# EAGLE design starfish (EAGLE 9.5.1)

## Sheet 1 of 6: POWER
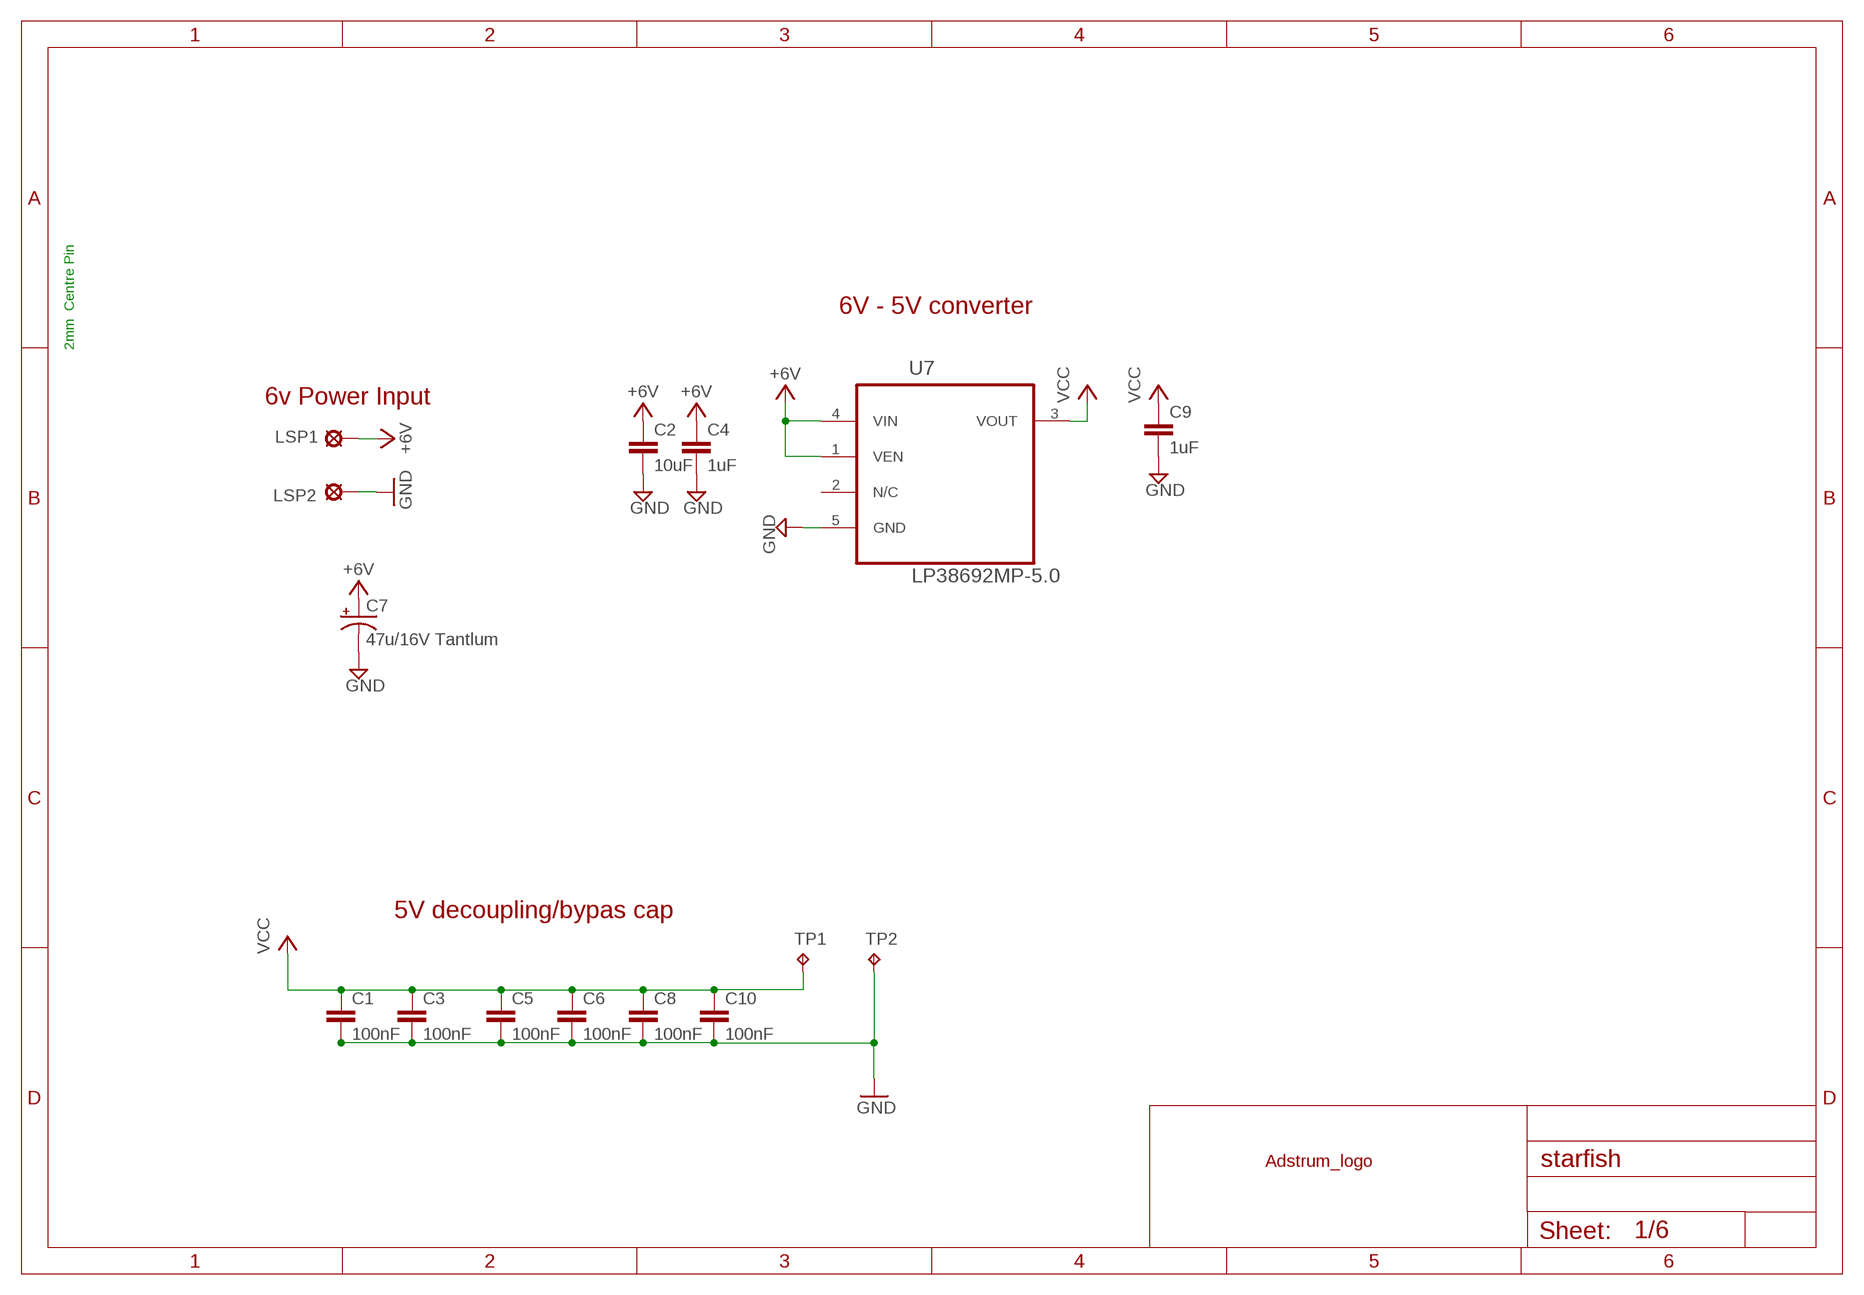
[diagram p0: schematic, sheet 1]

### Parts
C1  100nF  C-EUC1210  [C1210]
C2  10uF  C-EUC0805  [C0805]
C3  100nF  C-EUC0603  [C0603]
C4  1uF  C-EUC0805  [C0805]
C5  100nF  C-EUC0603  [C0603]
C6  100nF  C-EUC0603  [C0603]
C7  47u/16V Tantlum  CPOL-USC/6032-28R  [C/6032-28R]
C8  100nF  C-EUC0603  [C0603]
C9  1uF  C-EUC0805  [C0805]
C10  100nF  C-EUC0603  [C0603]
LSP1  LSP10  [LSP10]
LSP2  LSP10  [LSP10]
TP1  vcc  TPB1,27  [B1,27]
TP2  gnd  TPB1,27  [B1,27]
U7  LP38692MP-5.0  [SOT150P696X180-5N]
U$16  ADSTRUM_LOGO  [ADSTRUM_LOGO]

### Nets
+6V: C2.1 C4.1 C7.+ LSP1.MP U7.1(VEN) U7.4(VIN) ; also sheet 3,4,5
GND: C1.2 C2.2 C3.2 C4.2 C5.2 C6.2 C7.- C8.2 C9.2 C10.2 LSP2.MP TP2.TP U7.5(GND) ; also sheet 2,3,4,5,6
VCC: C1.1 C3.1 C5.1 C6.1 C8.1 C9.1 C10.1 TP1.TP U7.3(VOUT) ; also sheet 2,3,4,5,6
Unconnected: U7.2(N/C)

### Notes on the sheet
- 6V - 5V converter
- 2mm  Centre Pin
- 6v Power Input
- 5V decoupling/bypas cap

## Sheet 2 of 6: ATMEGA 2560
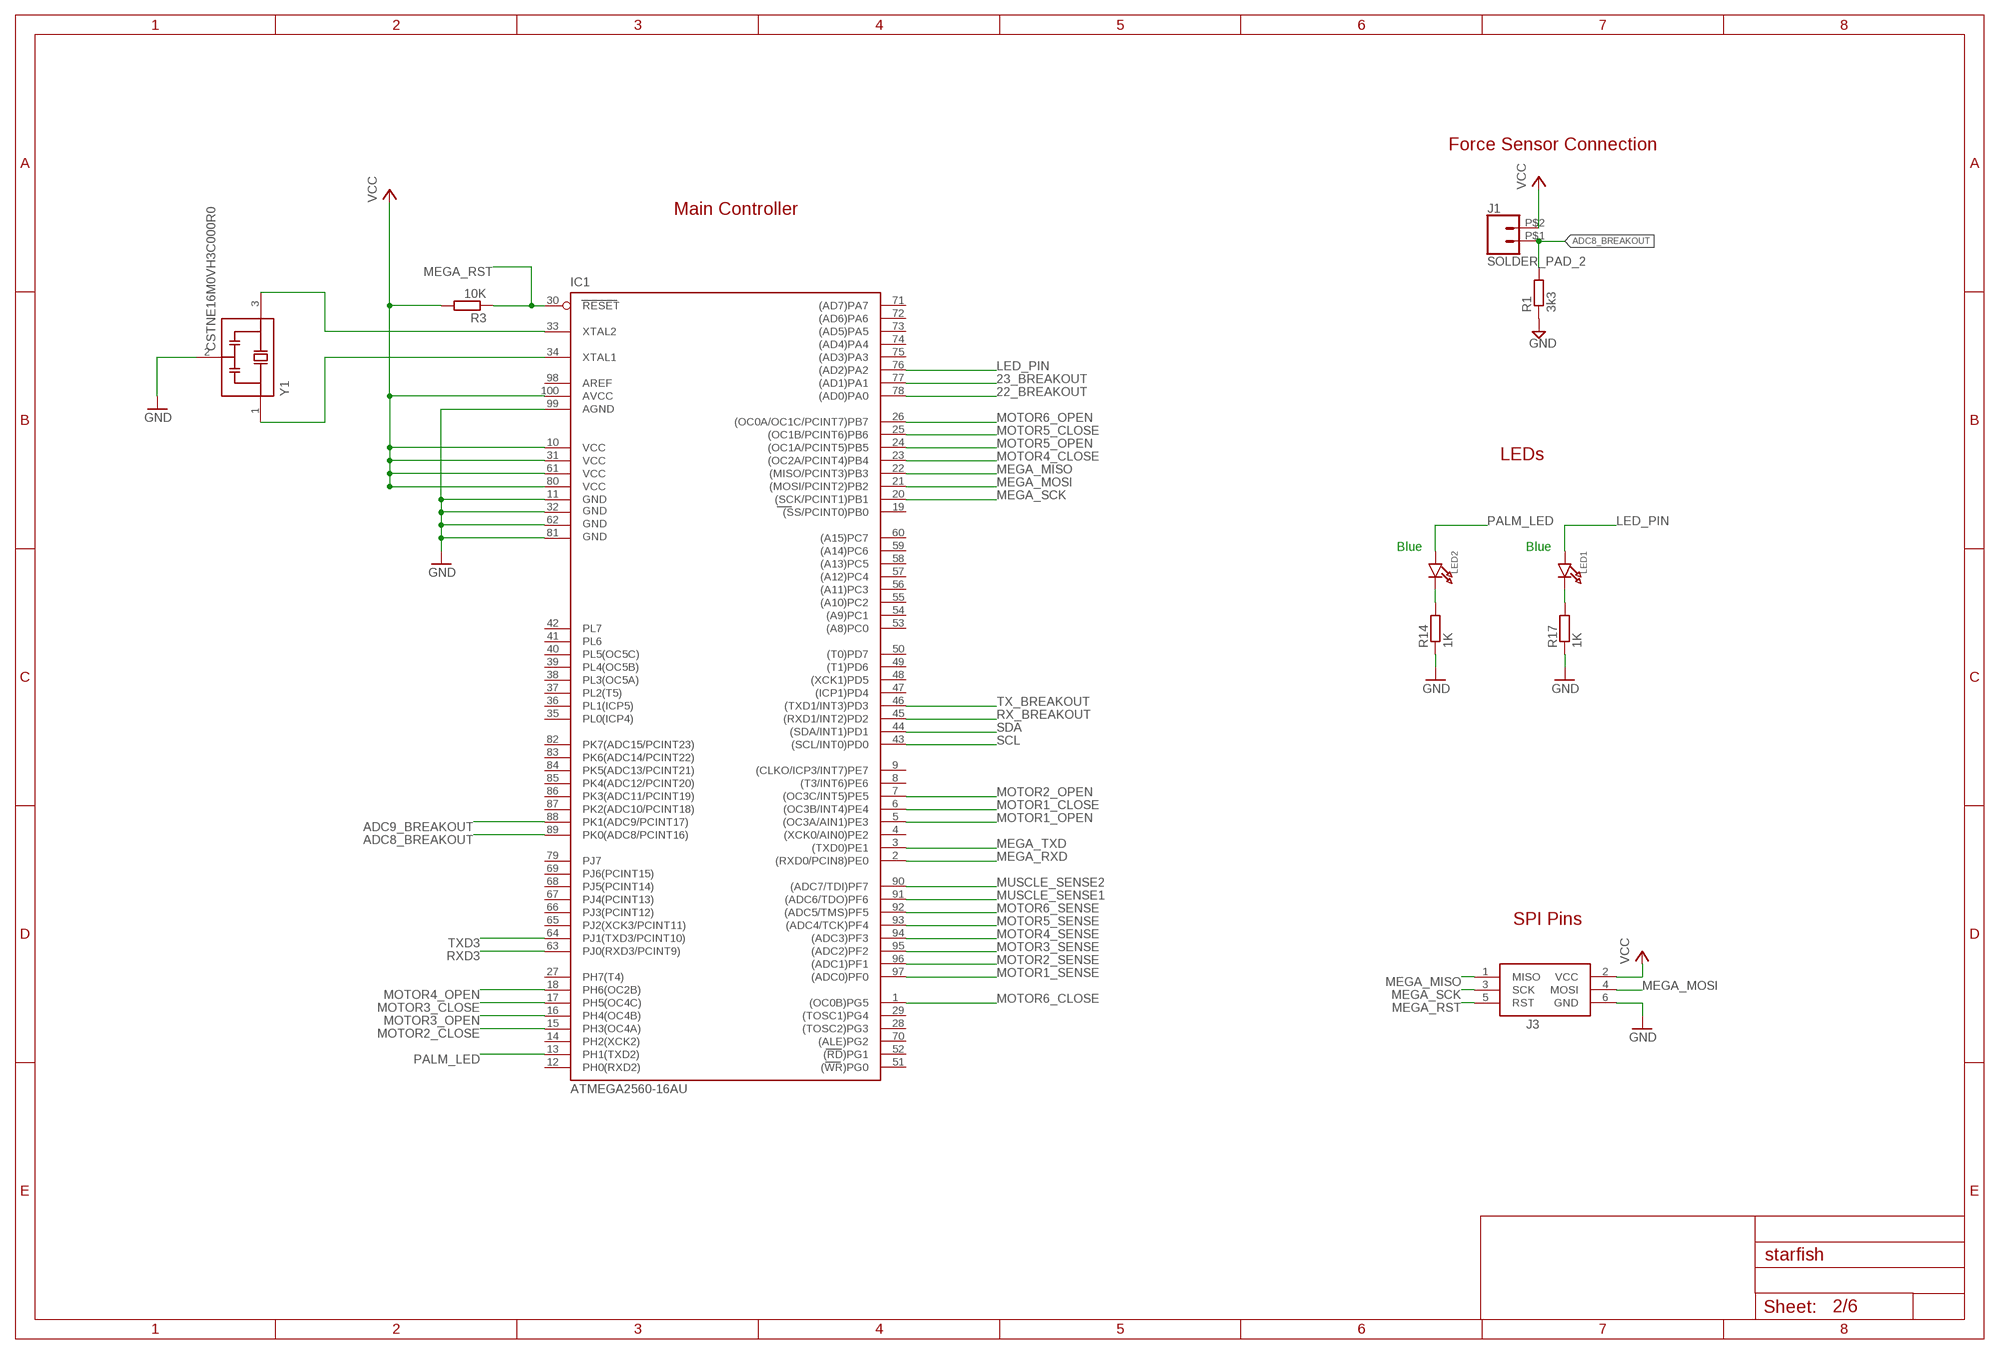
[diagram p1: schematic, sheet 2]

### Parts
IC1  ATMEGA2560-16AU  [TQFP100]
J1  SOLDER_PAD_2  [SOLDER_PAD_2]
J3  DNF  AVRISP-6  [AVRISP]
LED1  LED0805  [CHIPLED_0805]
LED2  LED0805  [CHIPLED_0805]
R1  3k3  R-EU_R0603  [R0603]
R3  10K  R-EU_R0603  [R0603]
R14  1K  R-EU_R0603  [R0603]
R17  1K  R-EU_R0603  [R0603]
Y1  CSTNE16M0VH3C000R0  [OSC_CSTNE16M0VH3C000R0]

### Nets
22_BREAKOUT: IC1.78((AD0)PA0)
23_BREAKOUT: IC1.77((AD1)PA1)
ADC8_BREAKOUT: IC1.89(PK0(ADC8/PCINT16)) J1.P$1 R1.2
ADC9_BREAKOUT: IC1.88(PK1(ADC9/PCINT17))
GND: IC1.11(GND) IC1.32(GND1) IC1.62(GND2) IC1.81(GND3) IC1.99(AGND) J3.6(GND) R1.1 R14.1 R17.1 Y1.2(GND) ; also sheet 1,3,4,5,6
LED_PIN: IC1.76((AD2)PA2) LED1.A
MEGA_MISO: IC1.22((MISO/PCINT3)PB3) J3.1(MISO)
MEGA_MOSI: IC1.21((MOSI/PCINT2)PB2) J3.4(MOSI)
MEGA_RST: IC1.30(RESET) J3.5(RST) R3.1 ; also sheet 6
MEGA_RXD: IC1.2((RXD0/PCIN8)PE0) ; also sheet 6
MEGA_SCK: IC1.20((SCK/PCINT1)PB1) J3.3(SCK)
MEGA_TXD: IC1.3((TXD0)PE1) ; also sheet 6
MOTOR1_CLOSE: IC1.6((OC3B/INT4)PE4) ; also sheet 3
MOTOR1_OPEN: IC1.5((OC3A/AIN1)PE3) ; also sheet 3
MOTOR1_SENSE: IC1.97((ADC0)PF0) ; also sheet 3
MOTOR2_CLOSE: IC1.15(PH3(OC4A)) ; also sheet 3
MOTOR2_OPEN: IC1.7((OC3C/INT5)PE5) ; also sheet 3
MOTOR2_SENSE: IC1.96((ADC1)PF1) ; also sheet 3
MOTOR3_CLOSE: IC1.17(PH5(OC4C)) ; also sheet 4
MOTOR3_OPEN: IC1.16(PH4(OC4B)) ; also sheet 4
MOTOR3_SENSE: IC1.95((ADC2)PF2) ; also sheet 3
MOTOR4_CLOSE: IC1.23((OC2A/PCINT4)PB4) ; also sheet 4
MOTOR4_OPEN: IC1.18(PH6(OC2B)) ; also sheet 4
MOTOR4_SENSE: IC1.94((ADC3)PF3) ; also sheet 3
MOTOR5_CLOSE: IC1.25((OC1B/PCINT6)PB6) ; also sheet 5
MOTOR5_OPEN: IC1.24((OC1A/PCINT5)PB5) ; also sheet 5
MOTOR5_SENSE: IC1.93((ADC4/TCK)PF4) ; also sheet 3
MOTOR6_CLOSE: IC1.1((OC0B)PG5) ; also sheet 5
MOTOR6_OPEN: IC1.26((OC0A/OC1C/PCINT7)PB7) ; also sheet 5
MOTOR6_SENSE: IC1.92((ADC5/TMS)PF5) ; also sheet 3
MUSCLE_SENSE1: IC1.91((ADC6/TDO)PF6) ; also sheet 6
MUSCLE_SENSE2: IC1.90((ADC7/TDI)PF7) ; also sheet 6
N$2: LED1.C R17.2
N$3: IC1.34(XTAL1) Y1.1(IN)
N$4: LED2.C R14.2
N$5: IC1.33(XTAL2) Y1.3(OUT)
PALM_LED: IC1.13(PH1(TXD2)) LED2.A
RX_BREAKOUT: IC1.45((RXD1/INT2)PD2)
RXD3: IC1.63(PJ0(RXD3/PCINT9)) ; also sheet 6
SCL: IC1.43((SCL/INT0)PD0) ; also sheet 6
SDA: IC1.44((SDA/INT1)PD1) ; also sheet 6
TX_BREAKOUT: IC1.46((TXD1/INT3)PD3)
TXD3: IC1.64(PJ1(TXD3/PCINT10)) ; also sheet 6
VCC: IC1.10(VCC) IC1.31(VCC1) IC1.61(VCC2) IC1.80(VCC3) IC1.100(AVCC) J1.P$2 J3.2(VCC) R3.2 ; also sheet 1,3,4,5,6
Unconnected: IC1.4((XCK0/AIN0)PE2) IC1.8((T3/INT6)PE6) IC1.9((CLKO/ICP3/INT7)PE7) IC1.12(PH0(RXD2)) IC1.14(PH2(XCK2)) IC1.19((SS/PCINT0)PB0) IC1.27(PH7(T4)) IC1.28((TOSC2)PG3) IC1.29((TOSC1)PG4) IC1.35(PL0(ICP4)) IC1.36(PL1(ICP5)) IC1.37(PL2(T5)) IC1.38(PL3(OC5A)) IC1.39(PL4(OC5B)) IC1.40(PL5(OC5C)) IC1.41(PL6) IC1.42(PL7) IC1.47((ICP1)PD4) IC1.48((XCK1)PD5) IC1.49((T1)PD6) IC1.50((T0)PD7) IC1.51((WR)PG0) IC1.52((RD)PG1) IC1.53((A8)PC0) IC1.54((A9)PC1) IC1.55((A10)PC2) IC1.56((A11)PC3) IC1.57((A12)PC4) IC1.58((A13)PC5) IC1.59((A14)PC6) IC1.60((A15)PC7) IC1.65(PJ2(XCK3/PCINT11)) IC1.66(PJ3(PCINT12)) IC1.67(PJ4(PCINT13)) IC1.68(PJ5(PCINT14)) IC1.69(PJ6(PCINT15)) IC1.70((ALE)PG2) IC1.71((AD7)PA7) IC1.72((AD6)PA6) IC1.73((AD5)PA5) IC1.74((AD4)PA4) IC1.75((AD3)PA3) IC1.79(PJ7) IC1.82(PK7(ADC15/PCINT23)) IC1.83(PK6(ADC14/PCINT22)) IC1.84(PK5(ADC13/PCINT21)) IC1.85(PK4(ADC12/PCINT20)) IC1.86(PK3(ADC11/PCINT19)) IC1.87(PK2(ADC10/PCINT18)) IC1.98(AREF)

### Notes on the sheet
- Force Sensor Connection
- Main Controller
- LEDs
- Blue | Blue
- SPI Pins

## Sheet 3 of 6: MOTOR 1&2
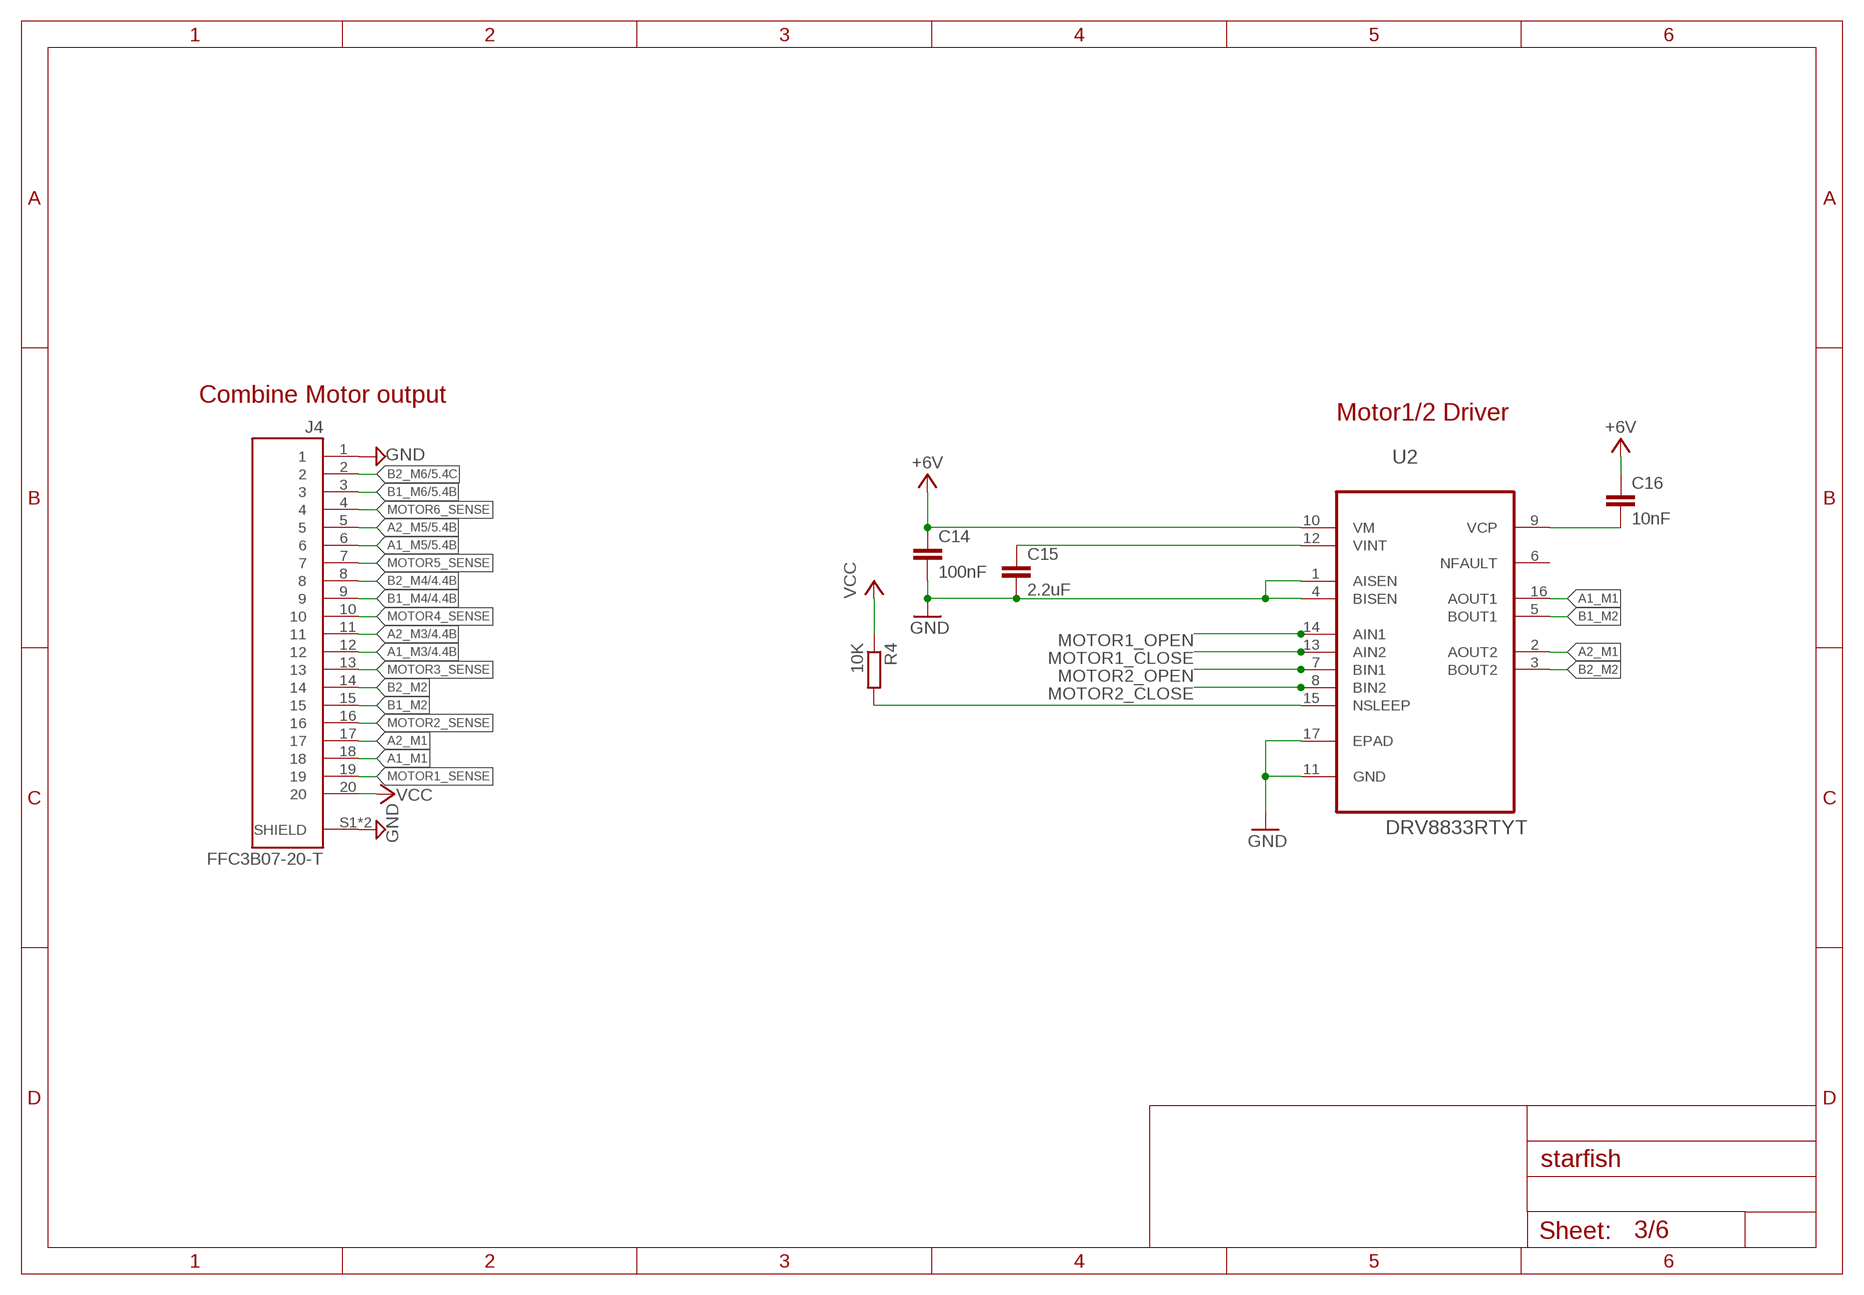
[diagram p2: schematic, sheet 3]

### Parts
C14  100nF  C-EUC0603  [C0603]
C15  2.2uF  C-EUC0603  [C0603]
C16  10nF  C-EUC0603  [C0603]
J4  FFC3B07-20-T  [GCT_FFC3B07-20-T]
R4  10K  R-EU_R0603  [R0603]
U2  DRV8833RTYT  [QFN65P400X400X80-17N]

### Nets
+6V: C14.1 C16.1 U2.10(VM) ; also sheet 1,4,5
A1_M1: J4.18 U2.16(AOUT1)
A1_M3: J4.12 ; also sheet 4
A1_M5: J4.6 ; also sheet 5
A2_M1: J4.17 U2.2(AOUT2)
A2_M3: J4.11 ; also sheet 4
A2_M5: J4.5 ; also sheet 5
B1_M2: J4.15 U2.5(BOUT1)
B1_M4: J4.9 ; also sheet 4
B1_M6: J4.3 ; also sheet 5
B2_M2: J4.14 U2.3(BOUT2)
B2_M4: J4.8 ; also sheet 4
B2_M6: J4.2 ; also sheet 5
GND: C14.2 C15.2 J4.1 J4.S1(SHIELD) J4.S2(SHIELD) U2.1(AISEN) U2.4(BISEN) U2.11(GND) U2.17(EPAD) ; also sheet 1,2,4,5,6
MOTOR1_CLOSE: U2.13(AIN2) ; also sheet 2
MOTOR1_OPEN: U2.14(AIN1) ; also sheet 2
MOTOR1_SENSE: J4.19 ; also sheet 2
MOTOR2_CLOSE: U2.8(BIN2) ; also sheet 2
MOTOR2_OPEN: U2.7(BIN1) ; also sheet 2
MOTOR2_SENSE: J4.16 ; also sheet 2
MOTOR3_SENSE: J4.13 ; also sheet 2
MOTOR4_SENSE: J4.10 ; also sheet 2
MOTOR5_SENSE: J4.7 ; also sheet 2
MOTOR6_SENSE: J4.4 ; also sheet 2
N$8: C16.2 U2.9(VCP)
N$38: R4.2 U2.15(NSLEEP)
N$42: C15.1 U2.12(VINT)
VCC: J4.20 R4.1 ; also sheet 1,2,4,5,6
Unconnected: U2.6(NFAULT)

### Notes on the sheet
- Combine Motor output
- Motor1/2 Driver

## Sheet 4 of 6: MOTOR 3&4
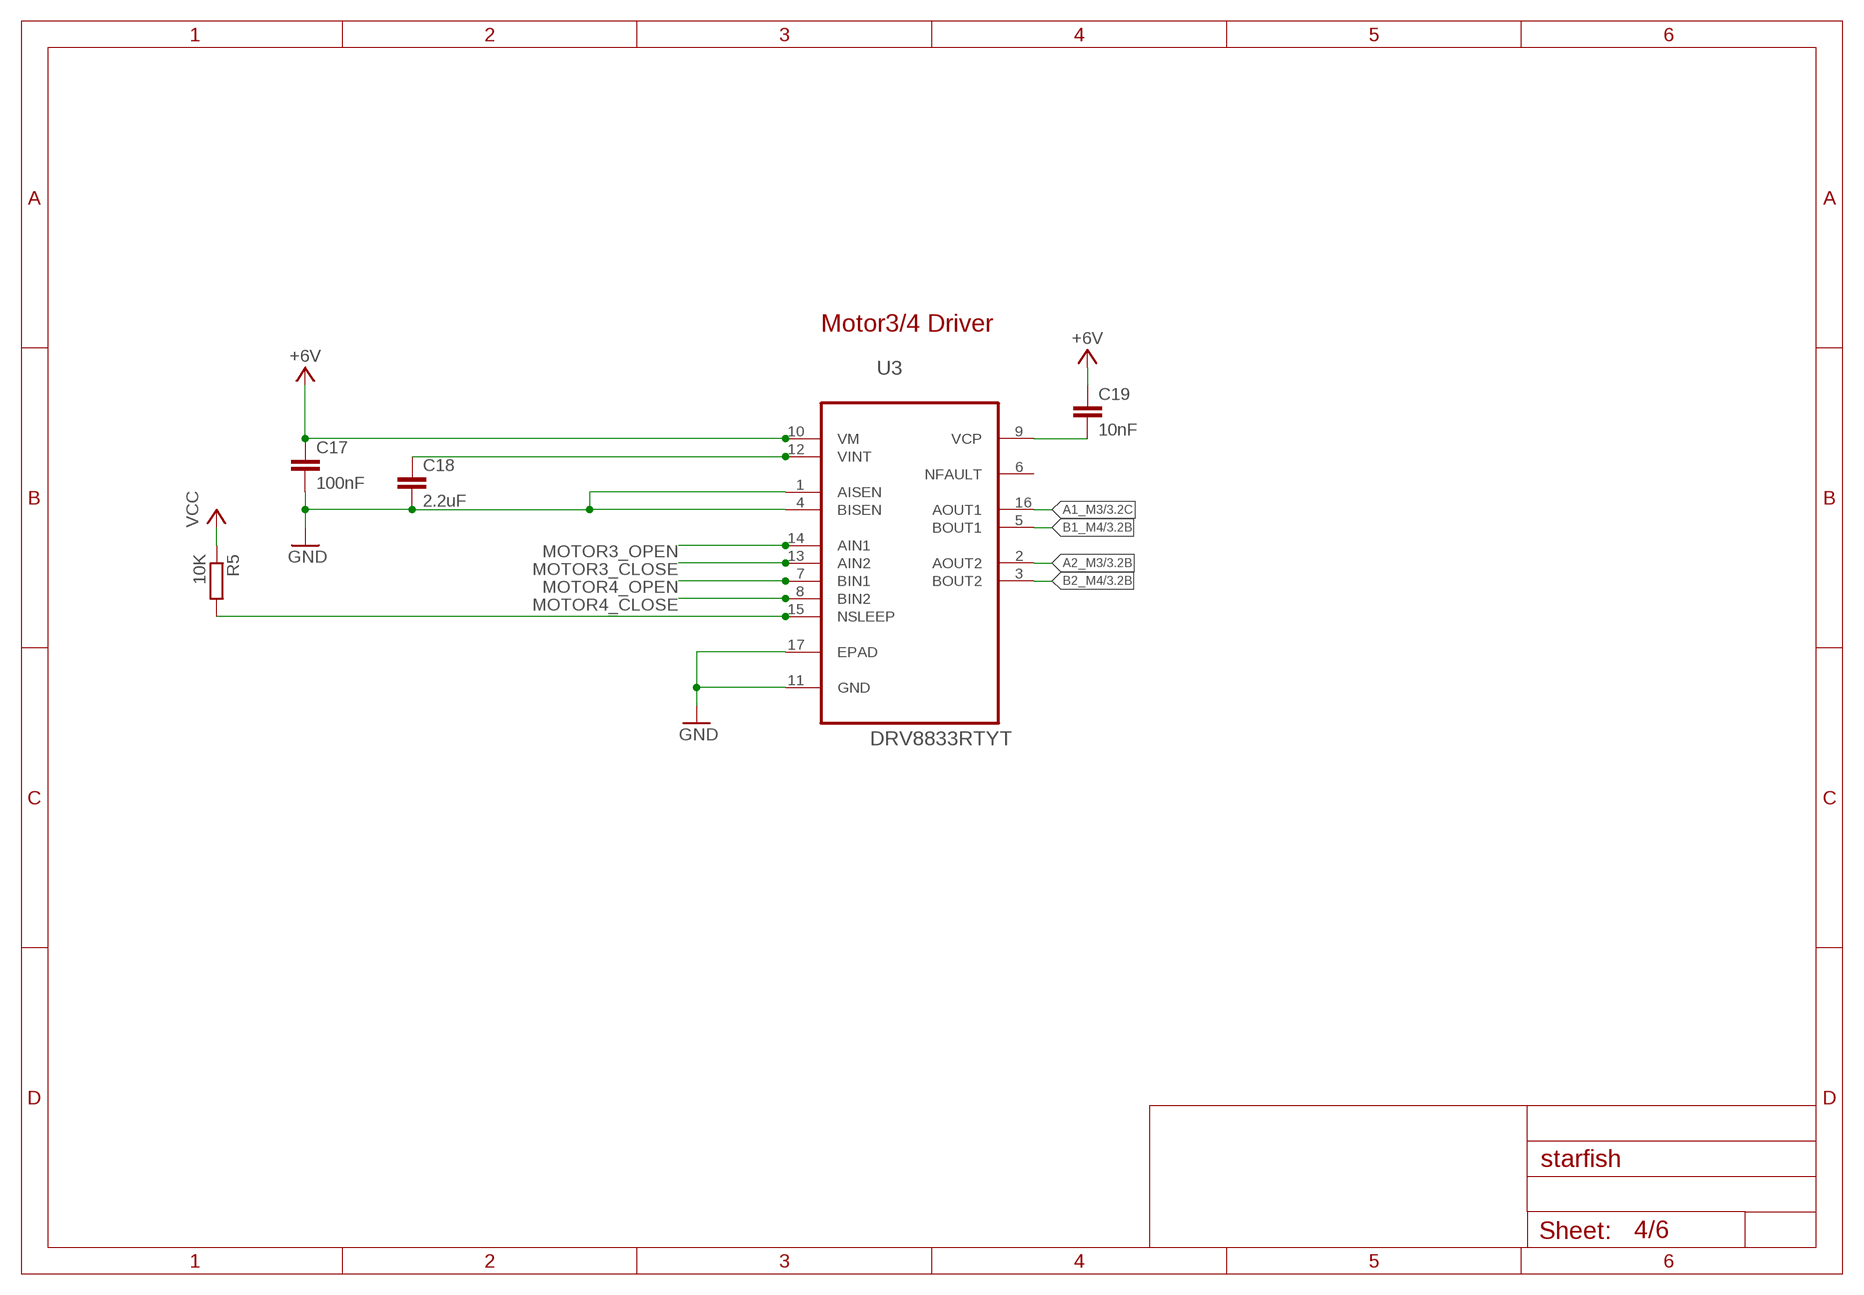
[diagram p3: schematic, sheet 4]

### Parts
C17  100nF  C-EUC0603  [C0603]
C18  2.2uF  C-EUC0603  [C0603]
C19  10nF  C-EUC0603  [C0603]
R5  10K  R-EU_R0603  [R0603]
U3  DRV8833RTYT  [QFN65P400X400X80-17N]

### Nets
+6V: C17.1 C19.1 U3.10(VM) ; also sheet 1,3,5
A1_M3: U3.16(AOUT1) ; also sheet 3
A2_M3: U3.2(AOUT2) ; also sheet 3
B1_M4: U3.5(BOUT1) ; also sheet 3
B2_M4: U3.3(BOUT2) ; also sheet 3
GND: C17.2 C18.2 U3.1(AISEN) U3.4(BISEN) U3.11(GND) U3.17(EPAD) ; also sheet 1,2,3,5,6
MOTOR3_CLOSE: U3.13(AIN2) ; also sheet 2
MOTOR3_OPEN: U3.14(AIN1) ; also sheet 2
MOTOR4_CLOSE: U3.8(BIN2) ; also sheet 2
MOTOR4_OPEN: U3.7(BIN1) ; also sheet 2
N$43: C19.2 U3.9(VCP)
N$44: C18.1 U3.12(VINT)
N$45: R5.2 U3.15(NSLEEP)
VCC: R5.1 ; also sheet 1,2,3,5,6
Unconnected: U3.6(NFAULT)

### Notes on the sheet
- Motor3/4 Driver

## Sheet 5 of 6: MOTOR 5 & SERVO
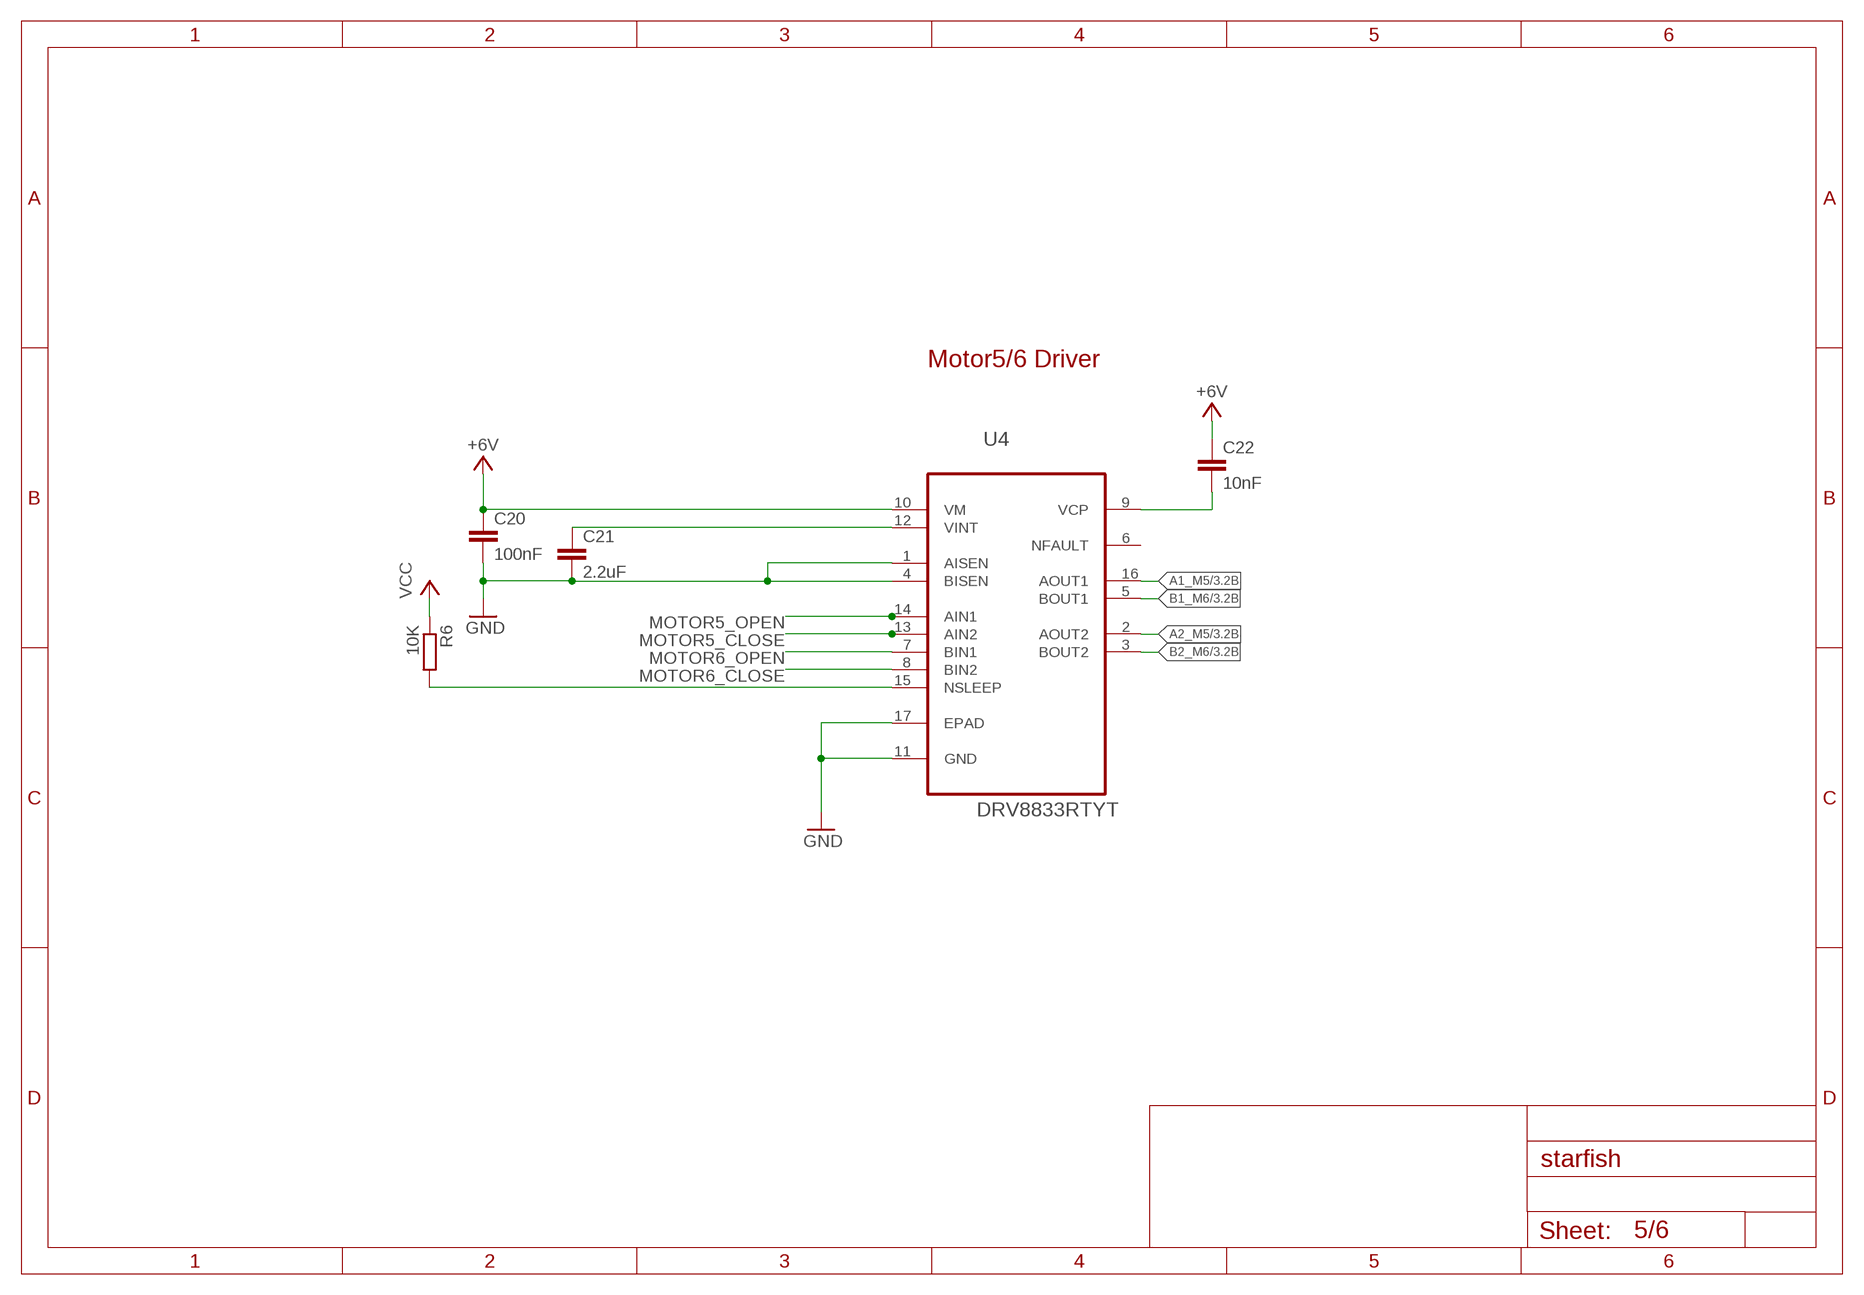
[diagram p4: schematic, sheet 5]

### Parts
C20  100nF  C-EUC0603  [C0603]
C21  2.2uF  C-EUC0603  [C0603]
C22  10nF  C-EUC0603  [C0603]
R6  10K  R-EU_R0603  [R0603]
U4  DRV8833RTYT  [QFN65P400X400X80-17N]

### Nets
+6V: C20.1 C22.1 U4.10(VM) ; also sheet 1,3,4
A1_M5: U4.16(AOUT1) ; also sheet 3
A2_M5: U4.2(AOUT2) ; also sheet 3
B1_M6: U4.5(BOUT1) ; also sheet 3
B2_M6: U4.3(BOUT2) ; also sheet 3
GND: C20.2 C21.2 U4.1(AISEN) U4.4(BISEN) U4.11(GND) U4.17(EPAD) ; also sheet 1,2,3,4,6
MOTOR5_CLOSE: U4.13(AIN2) ; also sheet 2
MOTOR5_OPEN: U4.14(AIN1) ; also sheet 2
MOTOR6_CLOSE: U4.8(BIN2) ; also sheet 2
MOTOR6_OPEN: U4.7(BIN1) ; also sheet 2
N$47: C21.1 U4.12(VINT)
N$49: C22.2 U4.9(VCP)
N$51: R6.2 U4.15(NSLEEP)
VCC: R6.1 ; also sheet 1,2,3,4,6
Unconnected: U4.6(NFAULT)

### Notes on the sheet
- Motor5/6 Driver

## Sheet 6 of 6: COMMS
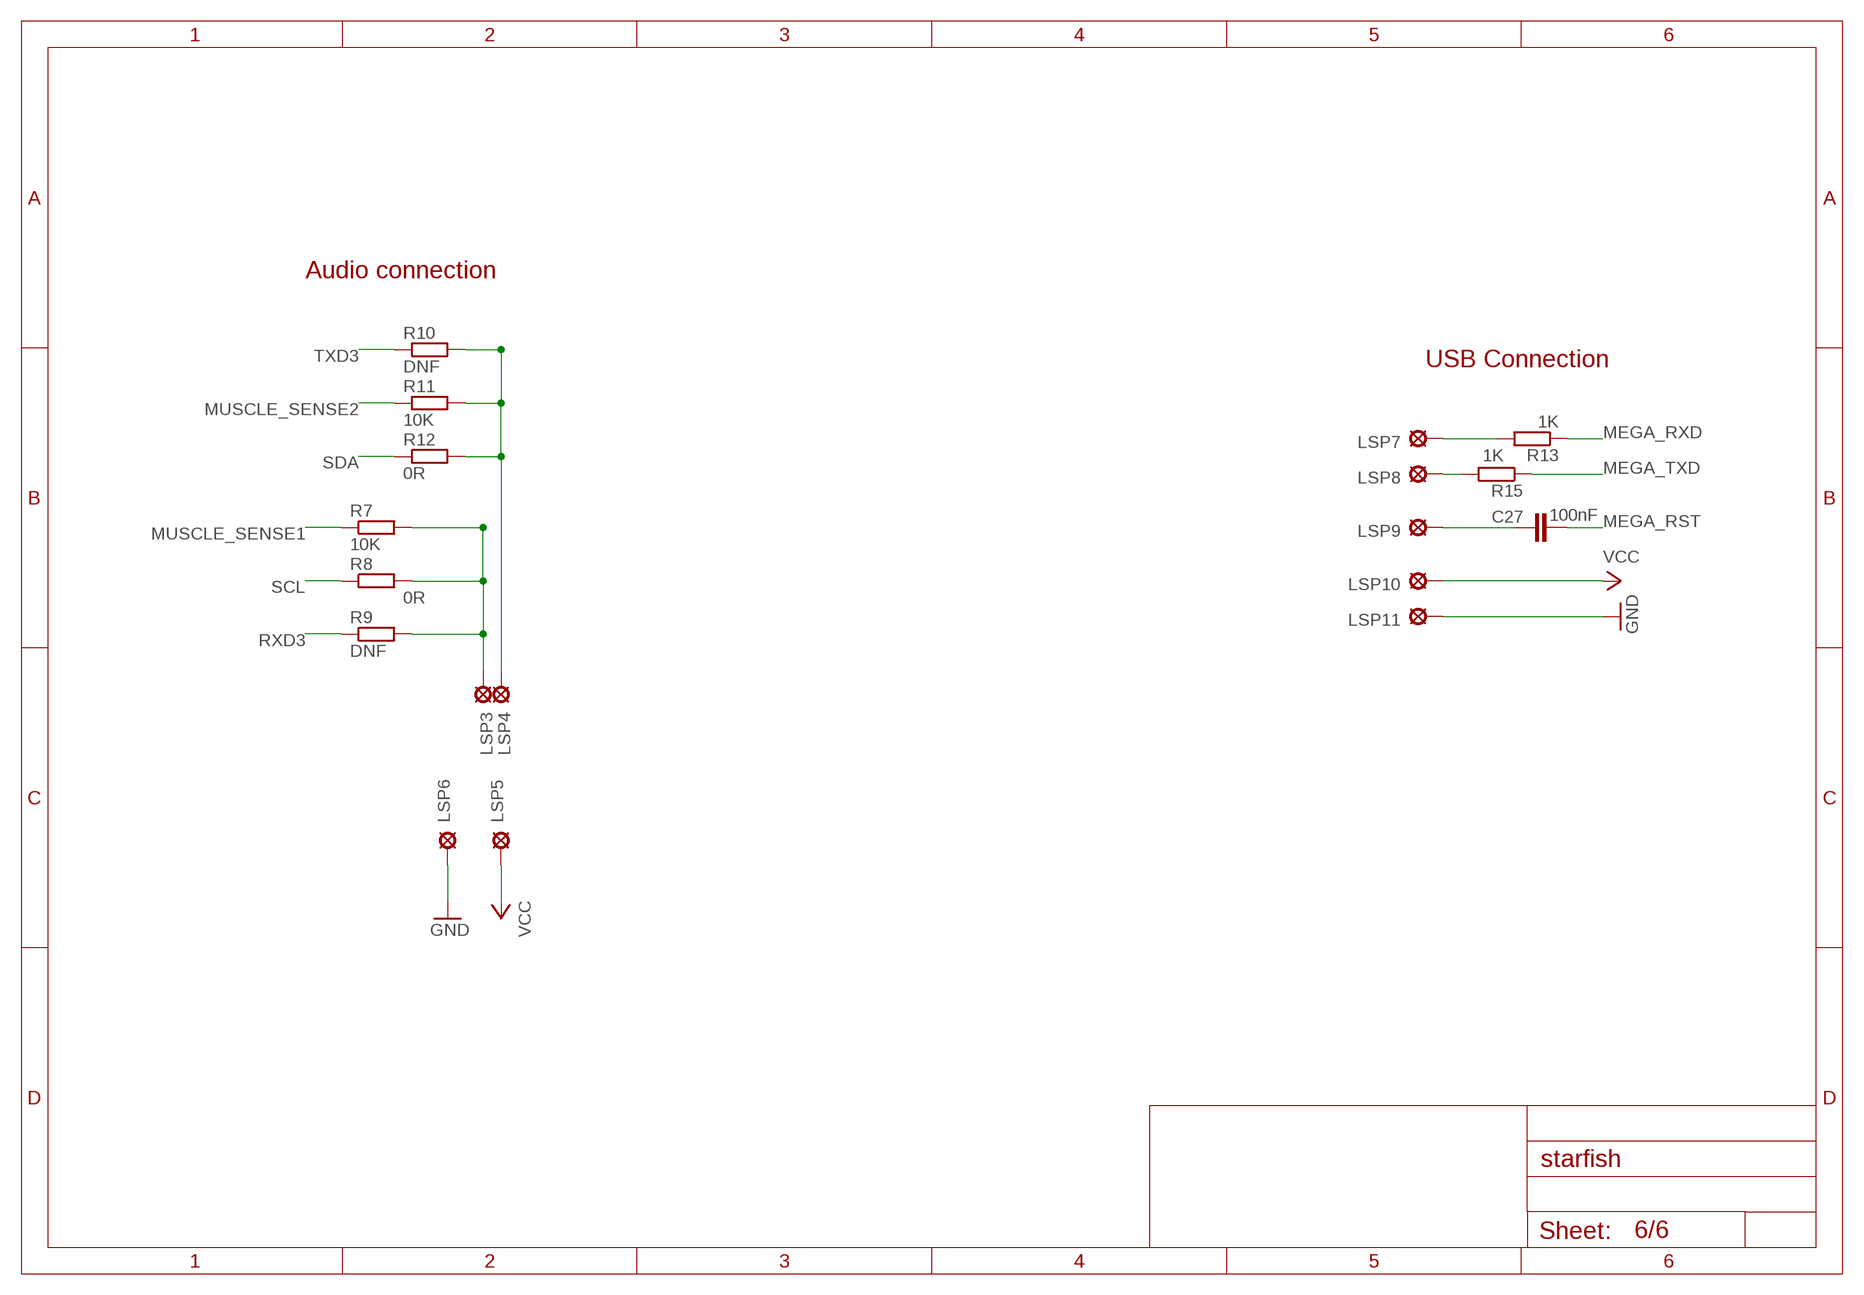
[diagram p5: schematic, sheet 6]

### Parts
C27  100nF  C-EUC0603  [C0603]
LSP3  LSP10  [LSP10]
LSP4  LSP10  [LSP10]
LSP5  LSP10  [LSP10]
LSP6  LSP10  [LSP10]
LSP7  LSP10  [LSP10]
LSP8  LSP10  [LSP10]
LSP9  LSP10  [LSP10]
LSP10  LSP10  [LSP10]
LSP11  LSP10  [LSP10]
R7  10K  R-EU_R0603  [R0603]
R8  0R  R-EU_R0603  [R0603]
R9  DNF  R-EU_R0603  [R0603]
R10  DNF  R-EU_R0603  [R0603]
R11  10K  R-EU_R0603  [R0603]
R12  0R  R-EU_R0603  [R0603]
R13  1K  R-EU_R0603  [R0603]
R15  1K  R-EU_R0603  [R0603]

### Nets
GND: LSP6.MP LSP11.MP ; also sheet 1,2,3,4,5
MEGA_RST: C27.2 ; also sheet 2
MEGA_RXD: R13.1 ; also sheet 2
MEGA_TXD: R15.1 ; also sheet 2
MUSCLE_SENSE1: R7.1 ; also sheet 2
MUSCLE_SENSE2: R11.1 ; also sheet 2
N$11: LSP4.MP R10.2 R11.2 R12.2
N$16: C27.1 LSP9.MP
N$17: LSP3.MP R7.2 R8.2 R9.2
N$18: LSP7.MP R13.2
N$19: LSP8.MP R15.2
RXD3: R9.1 ; also sheet 2
SCL: R8.1 ; also sheet 2
SDA: R12.1 ; also sheet 2
TXD3: R10.1 ; also sheet 2
VCC: LSP5.MP LSP10.MP ; also sheet 1,2,3,4,5

### Notes on the sheet
- Audio connection
- USB Connection

## Library data of the parts
C1-C6 C8-C10 C14-C22 C27 = resistor:C-EU: CAPACITOR, European symbol
C7 = rcl:CPOL-US: POLARIZED CAPACITOR, American symbol; SPICEPREFIX: C
IC1 = atmel-2005:ATMEGA*: MICROCONTROLLER 64/128/256 Kbytes FLASH 4 Kbytes EEPROM 8 Kbytes SRAM 86 General Purpose I/O pins 12-channels16-bit PWM 4 x Serial USARTs 16-channels 10-bit A/D
J1 = SparkFun-Connectors:SOLDER_PAD_2: Solder Pad for LuMini Rings
J3 = adafruit:AVRISP: AVR ISP HEADER Standard 6 pin header for AVR programming
J4 = FFC3B07-20-T:FFC3B07-20-T: FPC 1.0mm Pitch, Side entry, Top contact, SMT, Height 2.5mm, Slide type Check availability <https://pricing.snapeda.com/parts/FFC3B07-20-T/Global%20Connector%20Technology/view-part?ref=eda>; AVAILABILITY: In Stock; DESCRIPTION: 20 Position FFC, FPC Connector Contacts, Bottom 0.039 (1.00mm) Surface Mount, Right Angle; MF: Global Connector Technology; MP: FFC3B07-20-T; PACKAGE: None; PRICE: None; PURCHASE-URL: https://pricing.snapeda.com/search/part/FFC3B07-20-T/?ref=eda
LED1 LED2 = microbuilder:LED: LED 0603 - 0603 Surface Mount Package 2mA: Green LED - Low Power (3.9mcd, 2ma, 1.7Vf) - Digikey: 475-2709-2-ND Orange LED - Low Power (9.8mcd, 2ma, 1.8Vf) - Digikey: 475-1194-2-ND Red LED - Low Power (5mcd, 2ma, 1.8Vf) - Digikey: 475-1195-2-ND Yellow LED - Low Power (7mcd, 2ma, 1.8Vf) - Digikey: 475-1196-2-ND 5mA: Blue LED - Low Power (17mcd, 5ma, 2.9Vf) - Digikey: LNJ937W8CRACT-ND 0805 - 0805 Surface Mount Package 2mA: Red LED (8.8mcd, 2mA, 1.8Vf, Clear) - Low Power [Digikey: 475-2510-1-ND] Green LED (5mcd, 2mA, 1.8Vf, Clear) - Low Power [Digikey: 475-2730-1-ND] Yellow LED (11.3mcd, 2mA, 1.8Vf, Clear) - Low Power [Digikey: 475-2555-1-ND] 20mA: Red LED (104mcd, 20mA, Diffused) - LS R976 [Digikey: 475-1278-6-ND] Red LED (12mcd, 20mA, 2.0Vf, Clear) - APT2012EC [Digikey: 754-1128-1-ND] Green LED (15mcd, 20mA, 2.2Vf, Clear) - APT2012GC [Digikey: 754-1131-1-ND] Orange LED (160mcd, 20mA, 2.1Vf, Clear) - APT2012SECK [Digikey: 754-1130-1-ND] 1206 - 1206 Surface Mount Package Green LED (26mcd, 20mA, Diffused) - LG N971 [Digikey: 475-1407-6-ND] Red LED (15mcd, 20mA, Diffused) - LH N974 [Digikey: 475-1416-6-ND]
LSP1-LSP11 = solpad:LSP10: SOLDER PAD drill 1.0 mm, distributor Buerklin, 12H555
R1 R3-R15 R17 = resistor:R-EU_: RESISTOR, European symbol
TP1 TP2 = testpad:TP: Test pad
U2-U4 = DRV8833RTYT:DRV8833RTYT: DUAL H-BRIDGE MOTOR DRIVER,QFN-16; MPN: DRV8833RTYT; OC_FARNELL: 2057087; OC_NEWARK: 64T2942; PACKAGE: QFN-16; SUPPLIER: TEXAS INSTRUMENTS
U7 = LP38692MP-5.0:LP38692MP-5.0: Linear Regulator Check availability <https://pricing.snapeda.com/parts/LP38692MP-5.0/NOPB/Texas%20Instruments/view-part?ref=eda>; AVAILABILITY: In Stock; DESCRIPTION: 1-A, 10-V, low-dropout voltage regulator with enable; MF: Texas Instruments; MP: LP38692MP-5.0/NOPB; PACKAGE: SOT-223-5 Texas Instruments; PRICE: None; PURCHASE-URL: https://pricing.snapeda.com/search/part/LP38692MP-5.0/NOPB/?ref=eda
U$16 = ADSTRUM_LOGO:ADSTRUM_LOGO: ADSTRUM LOGO
Y1 = CSTNE16M0VH3C000R0:CSTNE16M0VH3C000R0: 16MHz Ceramic Resonator Built in Capacitor 15pF ±0.15% 40 Ohms -40°C ~ 125°C Surface Mount Check availability <https://pricing.snapeda.com/parts/CSTNE16M0VH3C000R0/Murata%20Electronics%20North%20America/view-part?ref=eda>; AVAILABILITY: In Stock; DESCRIPTION: 16 MHz Ceramic Resonator Built in Capacitor 15 pF ±0.13% 40 Ohms -40°C ~ 125°C Surface Mount; MF: Murata Electronics North America; MP: CSTNE16M0VH3C000R0; PACKAGE: SMD-3 Murata; PRICE: None; PURCHASE-URL: https://pricing.snapeda.com/search/part/CSTNE16M0VH3C000R0/?ref=eda

## Board
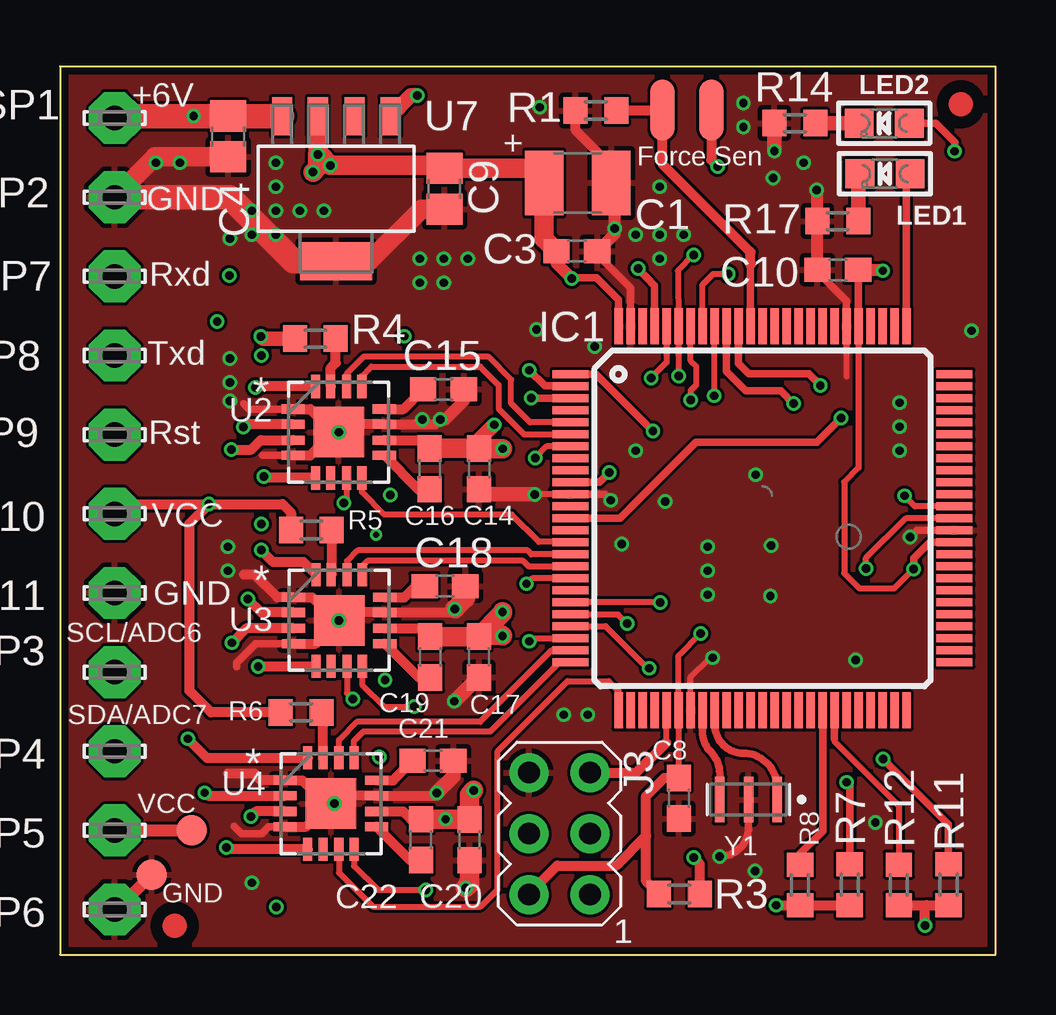
[diagram p6: board, top side]
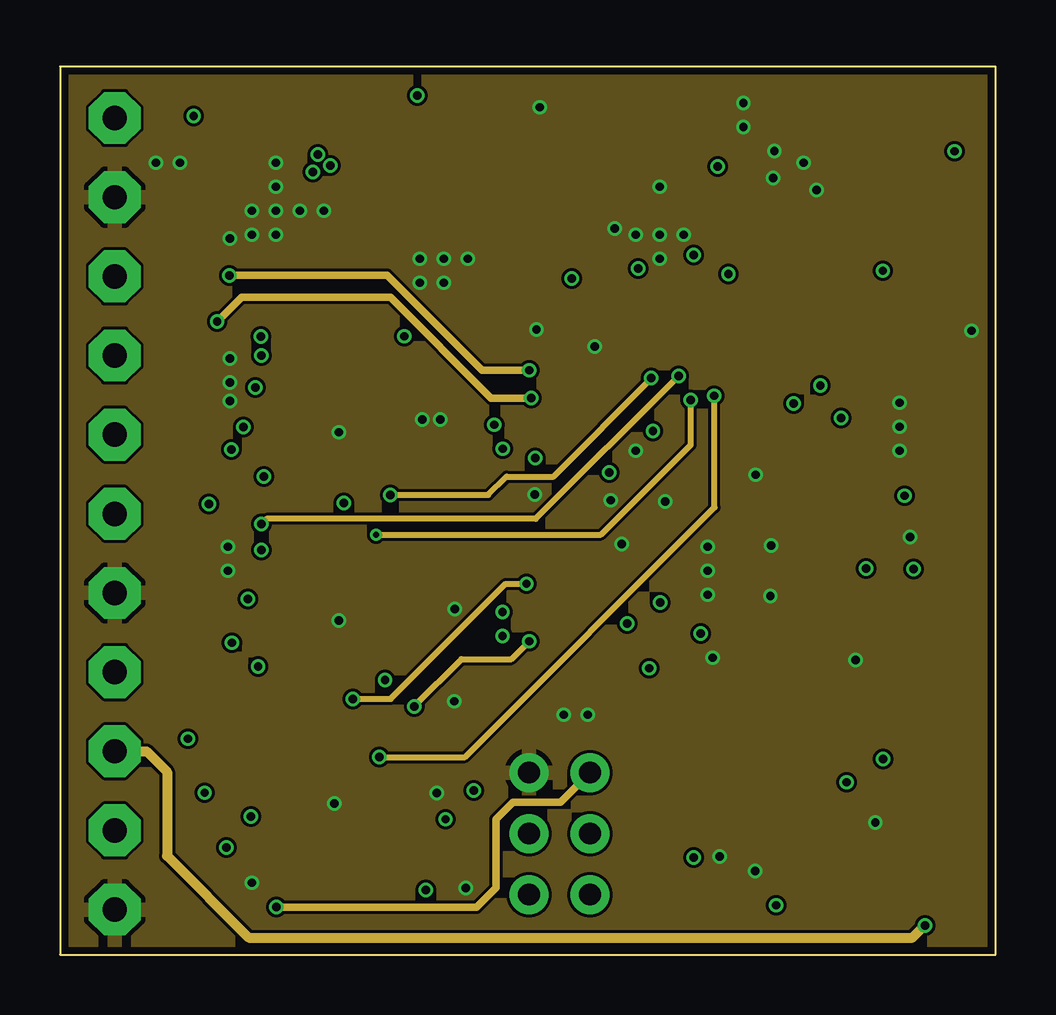
[diagram p7: board, inner layer Route2]
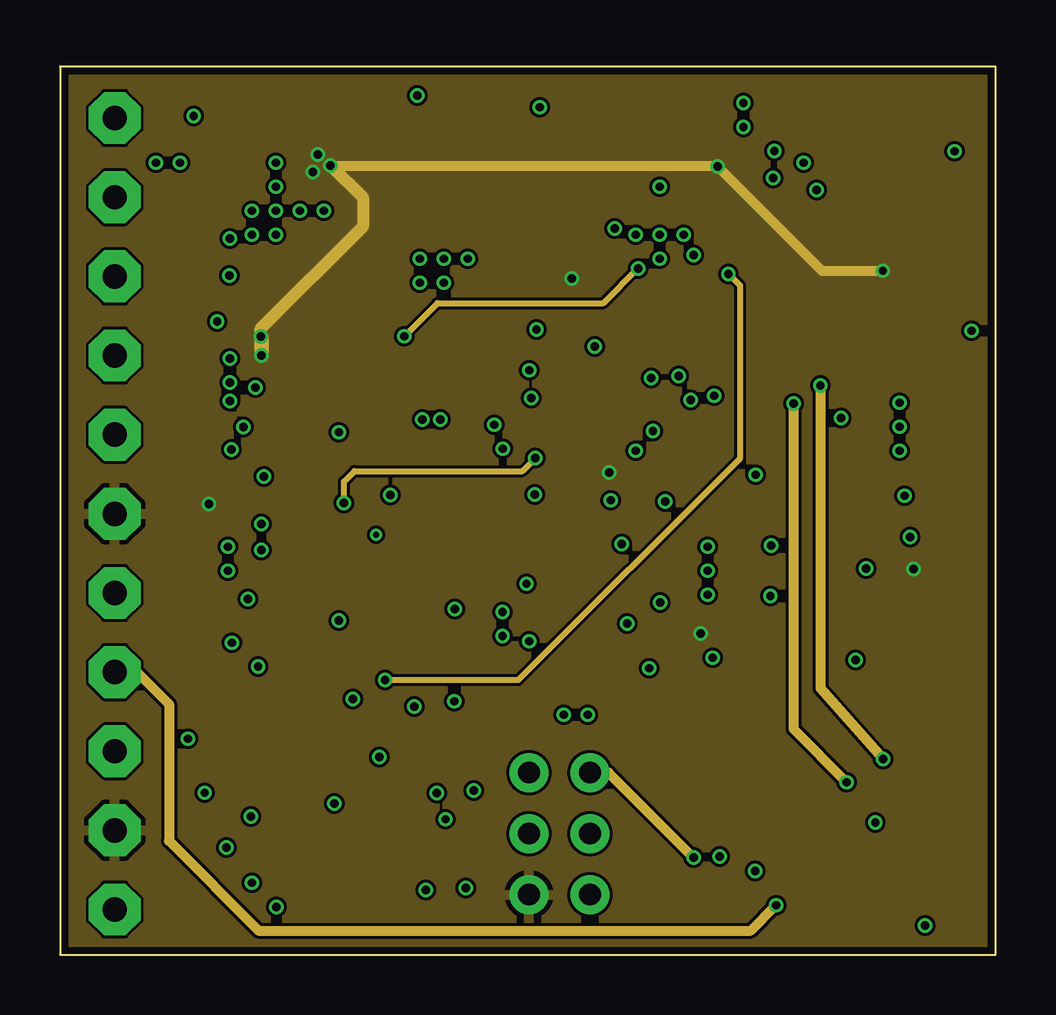
[diagram p8: board, inner layer Route15]
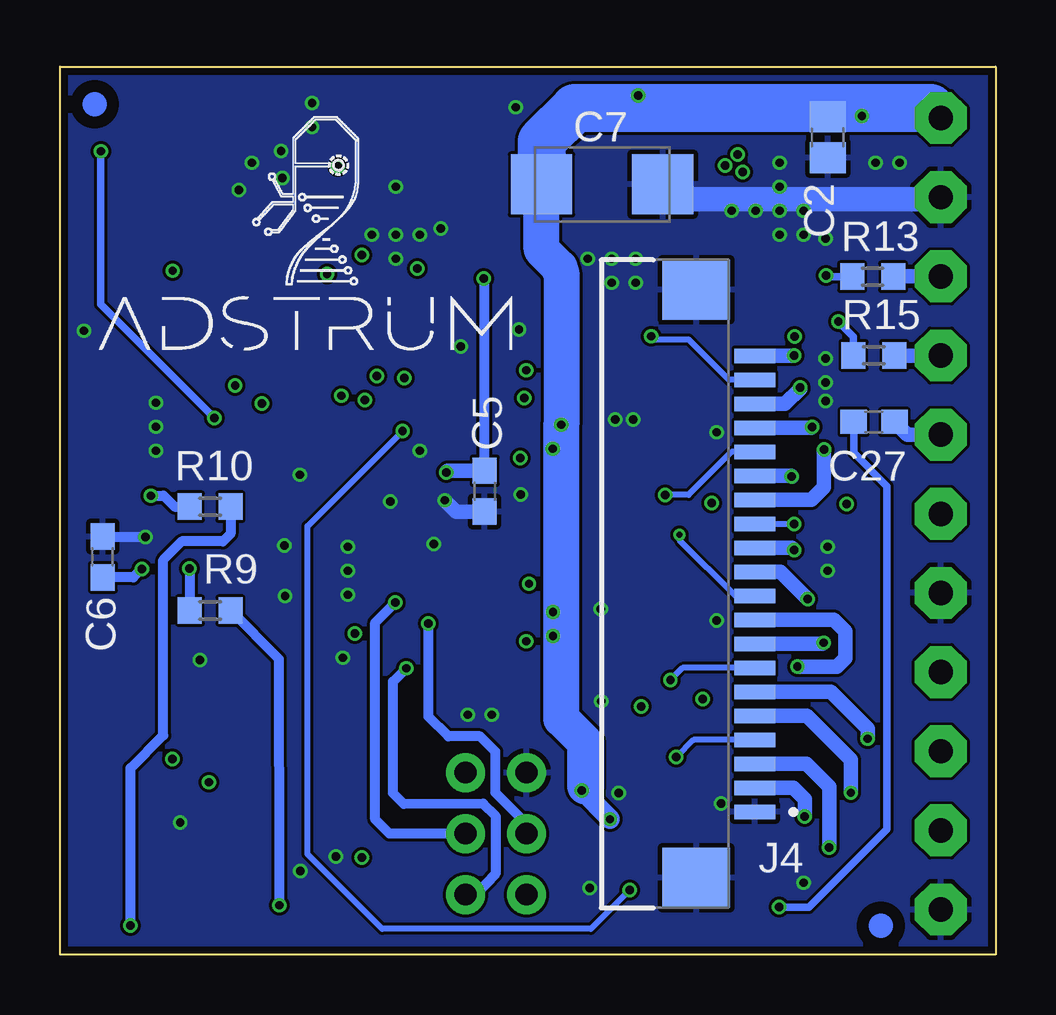
[diagram p9: board, bottom side, seen from below]

Size 39 x 37 mm. Coordinates in mm from the lower left corner, seen from the top.
Outline: 0,0 39,0 39,37 0,37 0,0
Copper layers (1*2*15*16): Top 0.035mm / dielectric 0.2mm / Route2 0.035mm / dielectric 1mm / Route15 0.035mm / dielectric 0.2mm / Bottom 0.035mm
Design rules "PCB-POOL HighSpec *": minimum track width 0.125mm, minimum drill 0.2mm, track to track 0.125mm, track to pad 0.125mm, pad to pad 0.125mm, via to via 0.125mm, smd to smd 0.125mm, copper to edge 0.3mm, drill to drill 0.2mm, minimum pad ring 0.2mm, minimum via ring 0.125mm, stop-mask expansion 0.075mm, vias tented up to drill 3mm, thermal gap 0.2mm

### Footprints (pad centres in the part's own frame; a part is rotated, then mirrored left to right if it is on the bottom)
C1210 = smd 1.6 x 2.7: 1 -1.4,0; 2 1.4,0
C0805 = smd 1.3 x 1.5: 1 -0.85,0; 2 0.85,0
C0603 = smd 1.1 x 1: 1 -0.85,0; 2 0.85,0
C/6032-28R = smd 2.55 x 2.5: + 2.525,0; - -2.525,0
TQFP100 = smd 1.5 x 0.35: 1 -8,6; 2 -8,5.5; 3 -8,5; 4 -8,4.5; 5 -8,4; 6 -8,3.5; 7 -8,3; 8 -8,2.5; 9 -8,2; 10 -8,1.5; 11 -8,1; 12 -8,0.5; 13 -8,0; 14 -8,-0.5; 15 -8,-1; 16 -8,-1.5; 17 -8,-2; 18 -8,-2.5; 19 -8,-3; 20 -8,-3.5; 21 -8,-4; 22 -8,-4.5; 23 -8,-5; 24 -8,-5.5; 25 -8,-6; 51 8,-6; 52 8,-5.5; 53 8,-5; 54 8,-4.5; 55 8,-4; 56 8,-3.5; 57 8,-3; 58 8,-2.5; 59 8,-2; 60 8,-1.5; 61 8,-1; 62 8,-0.5; 63 8,0; 64 8,0.5; 65 8,1; 66 8,1.5; 67 8,2; 68 8,2.5; 69 8,3; 70 8,3.5; 71 8,4; 72 8,4.5; 73 8,5; 74 8,5.5; 75 8,6 | smd 0.35 x 1.5: 26 -6,-8; 27 -5.5,-8; 28 -5,-8; 29 -4.5,-8; 30 -4,-8; 31 -3.5,-8; 32 -3,-8; 33 -2.5,-8; 34 -2,-8; 35 -1.5,-8; 36 -1,-8; 37 -0.5,-8; 38 0,-8; 39 0.5,-8; 40 1,-8; 41 1.5,-8; 42 2,-8; 43 2.5,-8; 44 3,-8; 45 3.5,-8; 46 4,-8; 47 4.5,-8; 48 5,-8; 49 5.5,-8; 50 6,-8; 76 6,8; 77 5.5,8; 78 5,8; 79 4.5,8; 80 4,8; 81 3.5,8; 82 3,8; 83 2.5,8; 84 2,8; 85 1.5,8; 86 1,8; 87 0.5,8; 88 0,8; 89 -0.5,8; 90 -1,8; 91 -1.5,8; 92 -2,8; 93 -2.5,8; 94 -3,8; 95 -3.5,8; 96 -4,8; 97 -4.5,8; 98 -5,8; 99 -5.5,8; 100 -6,8
SOLDER_PAD_2 = smd 1.016 x 2.54: P$1 -1.016,0; P$2 1.016,0
AVRISP = drill 0.9 pad 1.626: 1 -1.27,2.54; 2 1.27,2.54; 3 -1.27,0; 4 1.27,0; 5 -1.27,-2.54; 6 1.27,-2.54
GCT_FFC3B07-20-T = smd 0.6 x 1.7: 1 9.5,2.45; 2 8.5,2.45; 3 7.5,2.45; 4 6.5,2.45; 5 5.5,2.45; 6 4.5,2.45; 7 3.5,2.45; 8 2.5,2.45; 9 1.5,2.45; 10 0.5,2.45; 11 -0.5,2.45; 12 -1.5,2.45; 13 -2.5,2.45; 14 -3.5,2.45; 15 -4.5,2.45; 16 -5.5,2.45; 17 -6.5,2.45; 18 -7.5,2.45; 19 -8.5,2.45; 20 -9.5,2.45 | smd 2.5 x 2.8: S1 12.25,0; S2 -12.25,0
CHIPLED_0805 = smd 1.2 x 1.2: A 0,-1.05; C 0,1.05
LSP10 = drill 1.016 pad 2.159 octagon: MP 0,0
R0603 = smd 1 x 1.1: 1 -0.85,0; 2 0.85,0
B1,27 = smd 1.27 x 1.27: TP 0,0
QFN65P400X400X80-17N = smd 0.965 x 0.381: 1 -1.905,0.965; 2 -1.905,0.33; 3 -1.905,-0.33; 4 -1.905,-0.965; 9 1.905,-0.965; 10 1.905,-0.33; 11 1.905,0.33; 12 1.905,0.965 | smd 0.381 x 0.965: 5 -0.965,-1.905; 6 -0.33,-1.905; 7 0.33,-1.905; 8 0.965,-1.905; 13 0.965,1.905; 14 0.33,1.905; 15 -0.33,1.905; 16 -0.965,1.905 | smd 2.108 x 2.108: 17 0,0
SOT150P696X180-5N = smd 1.6 x 0.838: 1 -3.023,2.261; 2 -3.023,0.762; 3 -3.023,-0.762; 4 -3.023,-2.261 | smd 1.6 x 2.997: 5 3.023,0
OSC_CSTNE16M0VH3C000R0 = smd 0.4 x 1.9: 1 -1.2,0; 2 0,0; 3 1.2,0

### Placement (x,y rotation side)
C1  21.59,32.16 0 top
C2  7,34.06 270 bottom
C3  21.55,29.31 0 top
C4  7.01,34.09 270 top
C5  21.3,19.31 270 bottom
C6  37.22,16.58 90 bottom
C7  16.4,32.1 180 bottom
C8  25.8,6.52 270 top
C9  16.03,31.92 270 top
C10  32.42,28.53 180 top
C14  17.47,20.24 270 top
C15  15.99,23.55 0 top
C16  15.42,20.24 270 top
C17  17.46,12.41 270 top
C18  16.05,15.36 0 top
C19  15.43,12.41 270 top
C20  17.07,4.79 270 top
C21  15.55,8.08 0 top
C22  15.04,4.79 270 top
C27  5.07,22.21 180 bottom
IC1  29.29,18.19 0 top
J1  26.14,35.2 0 top
J3  20.82,5.04 180 top
J4  12.48,15.45 270 bottom
LED1  34.39,32.54 90 top
LED2  34.36,34.64 90 top
LSP1  2.28,34.86 0 top
LSP2  2.28,31.56 0 top
LSP3  2.28,11.78 0 top
LSP4  2.28,8.48 0 top
LSP5  2.28,5.18 0 top
LSP6  2.28,1.88 0 top
LSP7  2.28,28.26 0 top
LSP8  2.28,24.97 0 top
LSP9  2.28,21.67 0 top
LSP10  2.28,18.37 0 top
LSP11  2.28,15.07 0 top
R1  22.34,35.17 0 top
R3  25.82,2.53 180 top
R4  10.64,25.67 0 top
R5  10.48,17.7 0 top
R6  10.05,10.1 0 top
R7  32.92,2.91 270 top
R8  30.85,2.91 270 top
R9  32.74,14.34 0 bottom
R10  32.74,18.67 0 bottom
R11  37.04,2.92 270 top
R12  34.97,2.9 270 top
R13  5.12,28.26 0 bottom
R14  30.64,34.65 0 top
R15  5.08,24.97 0 bottom
R17  32.42,30.57 0 top
TP1  5.49,5.18 0 top
TP2  3.82,3.33 0 top
U2  11.62,21.77 0 top
U3  11.64,13.93 0 top
U4  11.29,6.3 0 top
U7  11.51,31.92 270 top
U$1  [CIRCLE-1MM-2R]  37.55,35.44 0 top
U$16  37.36,25.19 0 bottom
U$17  [CIRCLE-1MM-2R]  4.79,1.2 0 top
Y1  28.7,6.47 180 top

### Tracks (layer width: path | path; a pad name or v marks a point on that pad's centre or on a via)
+6V  (via drill 0.35)
  Top 0.406: U2.10 15.07,21.44 C16.1 | C19.1 15.09,13.6 U3.10 | U4.10 14.31,5.97 14.63,5.64 C22.1
  Top 0.61: U7.1 14.64,35.81 v14.89,35.81 | C14.1 17.47,21.45 v18.1,22.08
  Top 0.813: C16.1 C14.1 17.73,21.09 17.75,21.08 v18.45,21.08 | C19.1 C17.1 | C17.1 17.51,13.31 18.42,13.31 v18.45,13.28 | C22.1 v16.07,5.64 17.06,5.64 C20.1 17.06,6.67 v17.25,6.85 | C17.1 18.45,14.24 v18.45,14.28
  Top 1.016: LSP1.MP 2.36,34.94 v5.57,34.94 C4.1 U7.4
  Bottom 0.508: v18.1,22.08 18.1,21.44 v18.45,21.08 | v18.45,13.28 18.1,13.63 18.1,14
  Bottom 0.61: v14.89,35.81 15,35.7 15,35.28
  Bottom 0.813: 17.1,7 v17.25,6.85 16.07,5.67 v16.07,5.64
  Bottom 1.016: C2.1 5.61,34.91 v5.57,34.94
  Bottom 1.5: 17.1,7 17.1,8.83 18.1,9.82 18.1,14 v18.1,22.08 18.1,28.43 18.17,28.51 18.17,28.63 18.92,29.38 C7.+
  Bottom 2: LSP1.MP 2.7,35.28 15,35.28 17.54,35.28 18.92,33.89 C7.+
A1_M1  (via drill 0.35)
  Top 0.406: U2.16 8.18,23.68 v8.14,23.64
  Bottom 0.61: J4.18 8.77,22.95 8.14,23.58 v8.14,23.64
A1_M3  (via drill 0.35)
  Top 0.406: U3.16 10.15,16.36 8.89,16.36 v8.39,16.86
  Bottom 0.61: v8.39,16.86 8.48,16.95 J4.12
A1_M5  (via drill 0.35)
  Top 0.406: v5.33,9 6.12,8.21 U4.16
  Bottom 0.61: J4.6 6.86,10.95 5.33,9.42 v5.33,9
A2_M1  (via drill 0.35)
  Top 0.406: U2.2 7.76,22.1 v7.64,21.99
  Bottom 0.61: J4.17 7.68,21.95 v7.64,21.99
A2_M3  (via drill 0.35)
  Top 0.406: U3.2 8.39,14.26 v7.83,14.82
  Bottom 0.61: J4.11 8.96,15.95 v7.83,14.82
A2_M5  (via drill 0.35)
  Top 0.406: v6.03,6.75 6.15,6.63 U4.2
  Bottom 0.61: J4.5 7.86,9.95 6.03,8.12 v6.03,6.75
ADC8_BREAKOUT
  Top 0.305: IC1.89 28.78,28.75
  Top 0.406: 28.78,28.75 28.78,29.27 25.12,32.93 J1.P$1 25.1,35.17 R1.2
B1_M2  (via drill 0.35)
  Top 0.406: U2.5 8.55,19.87 v8.5,19.93
  Bottom 0.61: J4.15 8.52,19.95 v8.5,19.93
B1_M4  (via drill 0.35)
  Top 0.406: v8.26,12.01 U3.5
  Bottom 0.61: J4.9 6.74,13.95 6.26,13.47 6.26,12.34 6.61,12 8.25,12 v8.26,12.01
B1_M6  (via drill 0.35)
  Top 0.406: U4.5 7.01,4.39 v6.94,4.46
  Bottom 0.61: J4.3 7.88,7.95 6.93,7 v6.93,4.47 v6.94,4.46
B2_M2  (via drill 0.35)
  Top 0.406: v7.15,21.04 7.98,21.04 8.37,21.44 U2.3
  Bottom 0.61: v7.15,21.04 7.15,19.47 7.67,18.95 J4.14
B2_M4  (via drill 0.35)
  Top 0.406: U3.3 7.77,13.6 v7.17,13
  Bottom 0.61: J4.8 7.21,12.95 v7.17,13
B2_M6  (via drill 0.35)
  Top 0.406: U4.3 8.16,5.97 v7.96,5.77
  Bottom 0.61: v7.96,5.77 7.96,6.48 8.42,6.95 J4.2
GND  (via drill 0.35)
  Top 0.254: IC1.81 32.78,24.09 | IC1.32 26.28,11.55 27.11,12.38 v27.21,12.38 | IC1.99 | IC1.11 v19.8,19.19 v19.79,19.18
  Top 0.305: IC1.62 35.73,17.69 v35.44,17.4 | IC1.99 23.78,27.78 22.4,29.17 C3.2 | IC1.81 32.78,27.25 31.57,28.47 C10.2 | IC1.11 22.73,19.19 22.96,18.95 v22.96,18.94 | 9.72,12.96 U3.4 8.15,12.96 7.36,12.17 7.36,12 | U3.1 9.63,14.89 | U2.4 8.46,20.81 | U2.1 7.89,22.74 7.66,22.97 | U4.4 8.71,5.33 8.41,5.04 7.57,5.04 7.25,5.36 | Y1.2 28.7,5.29 arc-90 v27.51,4.1
  Top 0.406: U2.1 10.43,22.74 11.4,21.77 | U2.4 10.43,20.81 11.31,21.69 | 11.31,21.69 11.4,21.77 | U2.17 11.53,21.69 11.31,21.69 | U2.17 11.95,22.1 U2.11 15.64,22.1 v15.85,22.31 | U2.17 11.4,21.77 | U3.4 10.67,12.96 11.56,13.85 | 11.56,13.85 U3.17 11.64,13.96 12.01,14.33 12.07,14.26 U3.11 16.31,14.26 v16.46,14.41 | 11.56,13.85 10.52,14.89 U3.1 9.06,14.89 8.12,15.84 7.67,15.84 | v15.7,6.74 15.59,6.63 U4.11 11.57,6.63 11.24,6.3 | 7,7.54 8.09,7.54 8.37,7.26 U4.1 10.09,7.26 11.14,6.22 | C1.2 22.99,32.86 21.49,34.35 R1.1 | U4.4 10.27,5.33 10.79,5.86 10.79,5.87 11.14,6.22 | 11.14,6.22 11.23,6.3 11.24,6.3 | 11.24,6.3 U4.17
  Top 0.508: C3.2 23.13,30.04 v23.13,30.26 23.13,31.23 23.3,31.4 23.3,31.84 C1.2 | C10.2 R17.1 31.57,31.84 v31.55,31.87 | v15.85,22.31 16.06,22.31 16.84,23.08 C15.2 | LSP6.MP 2.37,1.88 TP2.TP
  Top 0.61: C14.2 17.68,19.18 v19.79,19.18 | R14.1 v29.78,33.5 | C17.2 17.44,11.56 v16.45,10.56 | v15.7,6.74 16.4,7.44 C21.2
  Top 0.813: 11.16,28.89 U7.5 12.89,28.89 15.07,31.07 C9.2 | LSP2.MP 3.96,33.24 C4.2 | C18.2 16.9,14.85 v16.46,14.41 | C20.2 17.06,2.94 v16.92,2.79
  Top 1.016: LSP2.MP 7.08,31.56 9.75,28.89 11.16,28.89
  Bottom 0.406: v35.44,17.4 37.19,17.4 C6.2
  Bottom 0.61: C5.2 22.49,18.46 v22.96,18.94
  Bottom 1.016: LSP2.MP 2.37,31.47 13.25,31.47 C7.-
  other vias: 16,28 16,29 15,28 15,29 17,29 15.11,22.3 27,16 29,20 27,15 27,17 24,21 35,22 35,23 35,21 38,26 25,29 25,30 25,32 28.49,34.49 28.49,35.5 29.74,32.36 25.23,18.88 23.42,17.11 22,10 21,10 7,17 7,16 7.09,23.84 7.09,23.07 8,3 5,33 4,33 9,31 10,31 11,31 9,30 8,30 8,31 9,32 9,33 24,30 26,30 31,33 11.44,6.31 11.63,13.92 11.62,21.77 7.09,24.84 7.09,29.84 19.87,26.05 22.3,25.35 20,35.31 29.62,14.95 29.65,17.05 33.17,12.28 33.99,5.51 28.98,3.49
  pour Top (rank 2): -33.7,-0.9 -33.7,45.6 41.8,45.6 41.8,-0.9
  pour Bottom (rank 2): -26.9,-0.5 -26.9,45.9 42.3,45.9 42.3,-0.5
  pour Route2: -29,-2.6 -29,47.4 44,47.4 44,-2.6
LED_PIN
  Top 0.305: IC1.76 35.28,32.39 LED1.A
MEGA_MISO  (via drill 0.35)
  Top 0.254: IC1.22 22.74,13.69 24.5,11.94 v24.56,11.94
  Bottom 0.406: J3.1 21.67,2.5 20.83,3.4 20.83,5.77 21.36,6.3 24.66,6.27 25.12,6.73 25.12,11.38 v24.56,11.94
MEGA_MOSI  (via drill 0.35)
  Top 0.254: v23.64,13.8 23.27,14.17 21.3,14.17 IC1.21
  Bottom 0.406: J3.4 19.55,5.46 20.85,6.76 20.85,8.46 21.49,9.09 22.81,9.09 23.64,9.93 v23.64,13.8
MEGA_RST  (via drill 0.35)
  Top 0.254: 25.27,8.84 25.27,10.17 IC1.30
  Top 0.406: J3.5 24.02,7.58 25.27,8.84 | R3.1 26.67,3.79 v26.41,4.04
  Route2 0.305: v9.02,1.99 17.37,1.99 18.19,2.8 18.19,5.65 18.88,6.35 20.86,6.35 J3.5
  Route15 0.406: v26.41,4.04 22.87,7.58 J3.5
  Bottom 0.305: C27.2 5.92,20.92 4.53,19.53 4.53,5.23 7.77,1.99 v9.02,1.99
MEGA_RXD  (via drill 0.35)
  Top 0.254: 21.27,23.7 IC1.2
  Top 0.305: v19.56,24.35 20.21,23.7 21.27,23.7
  Route2 0.305: v7.07,28.3 13.64,28.3 17.59,24.35 v19.56,24.35
  Bottom 0.305: R13.1 7.02,28.26 v7.07,28.3
MEGA_SCK  (via drill 0.35)
  Top 0.254: v25.02,14.68 IC1.20
  Bottom 0.406: J3.3 25.26,5.04 25.86,5.64 25.86,13.84 v25.02,14.68
MEGA_TXD  (via drill 0.35)
  Top 0.254: IC1.3
  Top 0.305: v19.65,23.2 21.27,23.2 IC1.3
  Route2 0.305: v6.55,26.38 7.57,27.4 13.77,27.4 17.98,23.2 v19.65,23.2
  Bottom 0.305: R15.1 5.93,25.75 v6.55,26.38
MOTOR1_CLOSE
  Top 0.254: U2.13 12.58,24.11 12.98,24.5 17.52,24.5 18.29,23.74 18.29,22.75 19.35,21.69 IC1.6
MOTOR1_OPEN
  Top 0.254: IC1.5 19.6,22.19 18.81,22.97 18.81,23.96 17.84,24.94 12.68,24.94 11.95,24.2 U2.14
MOTOR1_SENSE  (via drill 0.35)
  Top 0.254: IC1.97
  Top 0.305: IC1.97 24.79,27.88 v24.1,28.59
  Route15 0.254: v14.36,25.77 15.73,27.15 22.65,27.15 v24.1,28.59
  Bottom 0.254: J4.19 11.11,23.95 12.79,25.64 14.23,25.64 v14.36,25.77
MOTOR2_CLOSE
  Top 0.254: IC1.15 21.27,17.2 19.96,17.2 18.83,18.34 13.52,18.34 12.58,19.27 U2.8
MOTOR2_OPEN  (via drill 0.35)
  Top 0.254: IC1.7 20.29,21.18 19.82,20.71 v19.82,20.7 | U2.7 11.95,18.94 v11.84,18.83
  Route15 0.254: v19.82,20.7 19.28,20.16 12.28,20.16 11.84,19.71 v11.84,18.83
MOTOR2_SENSE  (via drill 0.35)
  Top 0.254: IC1.96 25.28,24.68 v24.64,24.04
  Route2 0.254: v13.77,19.16 17.85,19.16 18.62,19.93 20.57,19.93 24.66,24.02 v24.64,24.04
  Bottom 0.254: J4.16 11.01,20.95 12.8,19.16 v13.77,19.16
MOTOR3_CLOSE
  Top 0.254: U3.13 12.6,16.2 12.82,16.41 19.31,16.41 19.54,16.19 IC1.17
MOTOR3_OPEN
  Top 0.254: IC1.16 19.65,16.69 19.49,16.84 12.41,16.84 11.97,16.4 U3.14
MOTOR3_SENSE  (via drill 0.35)
  Top 0.254: v26.41,29.16 25.76,28.5 IC1.95 | IC1.95 | v25.79,24.11 v25.78,24.12 IC1.95
  Route2 0.254: v8.4,17.95 8.61,18.16 19.83,18.16 v25.78,24.11 v25.79,24.11
  Bottom 0.254: J4.13 v8.4,17.95
MOTOR4_CLOSE  (via drill 0.35)
  Top 0.254: v14.77,10.34 14.76,10.33 13.51,10.33 12.6,11.23 U3.8 | v19.57,13.06 19.69,13.19 IC1.23
  Route2 0.254: v14.77,10.34 16.74,12.31 18.82,12.31 v19.57,13.06
MOTOR4_OPEN  (via drill 0.35)
  Top 0.254: U3.7 11.97,10.91 v12.22,10.66 | IC1.18 19.68,15.69 v19.45,15.46
  Route2 0.254: v12.22,10.66 13.78,10.66 18.58,15.46 v19.45,15.46
MOTOR4_SENSE  (via drill 0.25, 0.35)
  Top 0.254: IC1.94 26.29,26.08 26.29,24.75 26.52,24.52 26.52,23.74 26.3,23.51 v26.3,23.11
  Route2 0.254: v13.17,17.5 22.55,17.5 26.3,21.25 v26.3,23.11
  Bottom 0.254: J4.10 10.84,14.95 13.17,17.28 v13.17,17.5
MOTOR5_CLOSE
  Top 0.254: U4.13 12.26,8.91 12.66,9.31 17.94,9.31 20.82,12.19 IC1.25
MOTOR5_OPEN
  Top 0.254: U4.14 11.62,8.94 12.38,9.7 17.51,9.7 20.5,12.69 IC1.24
MOTOR5_SENSE  (via drill 0.35)
  Top 0.254: IC1.93 26.78,27.92 27.23,28.37 v27.86,28.37
  Route15 0.254: v13.55,11.45 19.11,11.45 28.36,20.7 28.36,27.88 v27.86,28.37
  Bottom 0.254: J4.7 13.05,11.95 v13.55,11.45
MOTOR6_CLOSE  (via drill 0.35)
  Top 0.254: U4.8 12.26,3.7 13.26,2.7 v15.25,2.7
  Top 0.305: IC1.1 22.35,24.19 v24.72,21.82
  Bottom 0.254: v15.25,2.7 16.87,1.07 25.56,1.07 28.68,4.19 28.68,17.86 v24.72,21.82
MOTOR6_OPEN
  Top 0.254: IC1.26 23.28,10.99 22.87,11.4 21.16,11.4 18.24,8.48 18.24,2.72 17.52,2 13.05,2 11.62,3.42 U4.7
MOTOR6_SENSE  (via drill 0.35)
  Top 0.254: v27.28,23.29 IC1.92
  Route2 0.254: v27.28,23.29 27.28,18.64 16.88,8.24 v13.31,8.24
  Bottom 0.254: J4.4 12.59,8.95 v13.31,8.24
MUSCLE_SENSE1  (via drill 0.35)
  Top 0.305: IC1.91 27.78,24.31 28.6,23.5 30.05,23.5 v30.58,22.96 | v32.79,7.19 32.92,7.06 R7.1
  Route15 0.406: v30.58,22.96 30.58,9.41 v32.79,7.19
MUSCLE_SENSE2  (via drill 0.35)
  Top 0.305: IC1.90 28.28,24.65 28.73,24.21 31.22,24.21 v31.7,23.72 | v34.31,8.15 37.04,5.43 R11.1
  Route15 0.406: v34.31,8.15 31.7,11.1 v31.7,23.72
N$2
  Top 0.61: R17.2 33.27,32.48 LED1.C
N$3
  Top 0.305: IC1.34 27.28,9.63 arc45 27.66,8.73 arc45 28.46,8.4 arc-90 29.9,6.96 Y1.1
N$4
  Top 0.61: R14.2 LED2.C
N$5
  Top 0.305: IC1.33 26.78,9.28 arc45 27.13,8.46 arc-45 27.5,7.55 Y1.3
N$8
  Top 0.406: U2.9 14.94,19.39 C16.2
N$11  (via drill 0.35)
  Top 0.406: R12.2 36.11,2.06 | R11.2 36.12,2.07 36.11,2.06 | v36.05,1.23 36.05,2 36.11,2.06
  Route2 0.406: LSP4.MP 3.61,8.48 4.46,7.62 4.46,4.12 7.87,0.71 35.54,0.71 v36.05,1.23
  Bottom 0.406: R10.2 31.89,17.54 32.21,17.22 33.92,17.22 34.69,16.45 34.69,9.14 36.05,7.77 v36.05,1.23
N$16
  Bottom 0.61: LSP9.MP 3.68,21.67 C27.1
N$17  (via drill 0.35)
  Top 0.305: R7.2
  Top 0.406: R7.2 R8.2 v29.85,2.06
  Route15 0.406: LSP3.MP 3.22,11.78 4.55,10.45 4.55,4.74 8.28,1.01 28.8,1.01 v29.85,2.06
  Bottom 0.406: R9.2 29.88,12.33 29.86,3.33 29.86,2.07 v29.85,2.06
N$18
  Bottom 0.61: LSP7.MP R13.2
N$19
  Bottom 0.61: LSP8.MP R15.2
N$38
  Top 0.406: U2.15 11.29,24.45 11.5,24.66 R4.2
N$42
  Top 0.406: U2.12 14.32,22.74 C15.1
N$43
  Top 0.406: U3.9 14.95,11.56 C19.2
N$44
  Top 0.406: U3.12 14.35,14.89 14.82,15.36 C18.1
N$45
  Top 0.406: U3.15 11.33,15.86 R5.2
N$47
  Top 0.406: U4.12 13.89,7.26 C21.1
N$49
  Top 0.406: U4.9 14.59,3.94 C22.2
N$51
  Top 0.406: U4.15 10.96,10.04 R6.2
PALM_LED  (via drill 0.35)
  Top 0.305: IC1.13 23.34,18.19 26.51,21.36 31.55,21.36 v32.57,22.37 | v37.29,33.48 37.29,33.86 36.51,34.64 LED2.A
  Bottom 0.305: v32.57,22.37 37.29,27.09 v37.29,33.48
RXD3  (via drill 0.35)
  Top 0.254: IC1.63 35.25,18.19 33.6,16.54 v33.6,16.1
  Bottom 0.406: v33.6,16.1 33.59,16.08 R9.1
SCL
  Top 0.305: IC1.43 31.79,10.18 31.79,5.15 30.85,4.21 R8.1
SDA
  Top 0.254: 32.28,8.99 32.28,8.89 34.97,6.2 R12.1
  Top 0.305: IC1.44 32.28,8.99
TXD3  (via drill 0.35)
  Top 0.254: IC1.64 35.64,18.69 v35.2,19.13
  Bottom 0.406: v35.2,19.13 34.68,19.13 34.22,18.67 R10.1
VCC  (via drill 0.35)
  Top 0.254: IC1.100 | 33.27,26.2 IC1.80 33.28,20.29 32.69,19.69 32.69,15.9 33.32,15.27 34.77,15.27 v35.59,16.08 | 37.27,17.17 IC1.61 | IC1.10 | J3.2 19.55,2.54 | C8.1 25.78,7.36 IC1.31 25.78,12.46 v26.71,13.39
  Top 0.305: IC1.61 36.26,17.19 35.59,16.52 v35.59,16.08 | IC1.100 23.28,27.3 22.37,28.21 21.36,28.21 v21.33,28.18 | 20.7,29.03 C3.1 | IC1.80 33.28,28.52 C10.1 | IC1.10 22.49,19.69 v22.9,20.1
  Top 0.406: 19.55,2.54 20.73,3.71 23.19,3.71 24.43,4.95 | 24.43,4.95 24.43,6.6 25.2,7.37 C8.1 | R5.1 9.63,18.42 9.28,18.78 v6.21,18.78 | LSP10.MP 2.69,18.78 v6.21,18.78 | R6.1 6.3,10.1 5.4,11 5.4,17.97 v6.21,18.78 | R3.2 24.43,3.06 24.43,4.95 | J1.P$2 27.16,33.11 v27.41,32.85
  Top 0.508: C3.1 20.7,28.8 v21.33,28.18 | C10.1 34.27,28.53 v34.3,28.5 | LSP5.MP TP1.TP
  Top 0.61: R4.1 8.46,25.67 v8.38,25.76
  Top 0.813: U7.3 v10.75,33.35 | v10.75,33.35 10.81,33.35 v11.27,32.89 15.9,32.89 C9.1 19.58,32.77 C1.1 20.19,29.83 C3.1 | v10.75,33.35 10.75,32.81 v10.54,32.61
  Route15 0.406: v34.3,28.5 31.76,28.5 v27.41,32.85 11.32,32.85 v11.27,32.89
  Route15 0.508: v8.38,25.76 8.38,26.11 12.65,30.39 12.65,31.52 v11.27,32.89
  Route15 0.61: v8.38,25.76 8.4,25.74 v8.4,24.96
  Bottom 0.406: v35.59,16.08 35.94,15.72 C6.1 | v21.33,28.18 21.33,20.19 C5.1
  Bottom 0.61: C5.1 22.84,20.16 v22.9,20.1 | J4.20 v8.41,24.95 v8.4,24.96
  pour Route15: -31.5,-4.4 -31.5,50 42.9,50 42.9,-4.4

### Text on the board
tNames: +6V | + | Force Sen | GND | Rxd | Txd | Rst | VCC | GND | SCL/ADC6 | SDA/ADC7 | VCC | GND